# EasyEDA Pro project ProPrj_STM32H723、_2026-06-01.epro, board PCB1
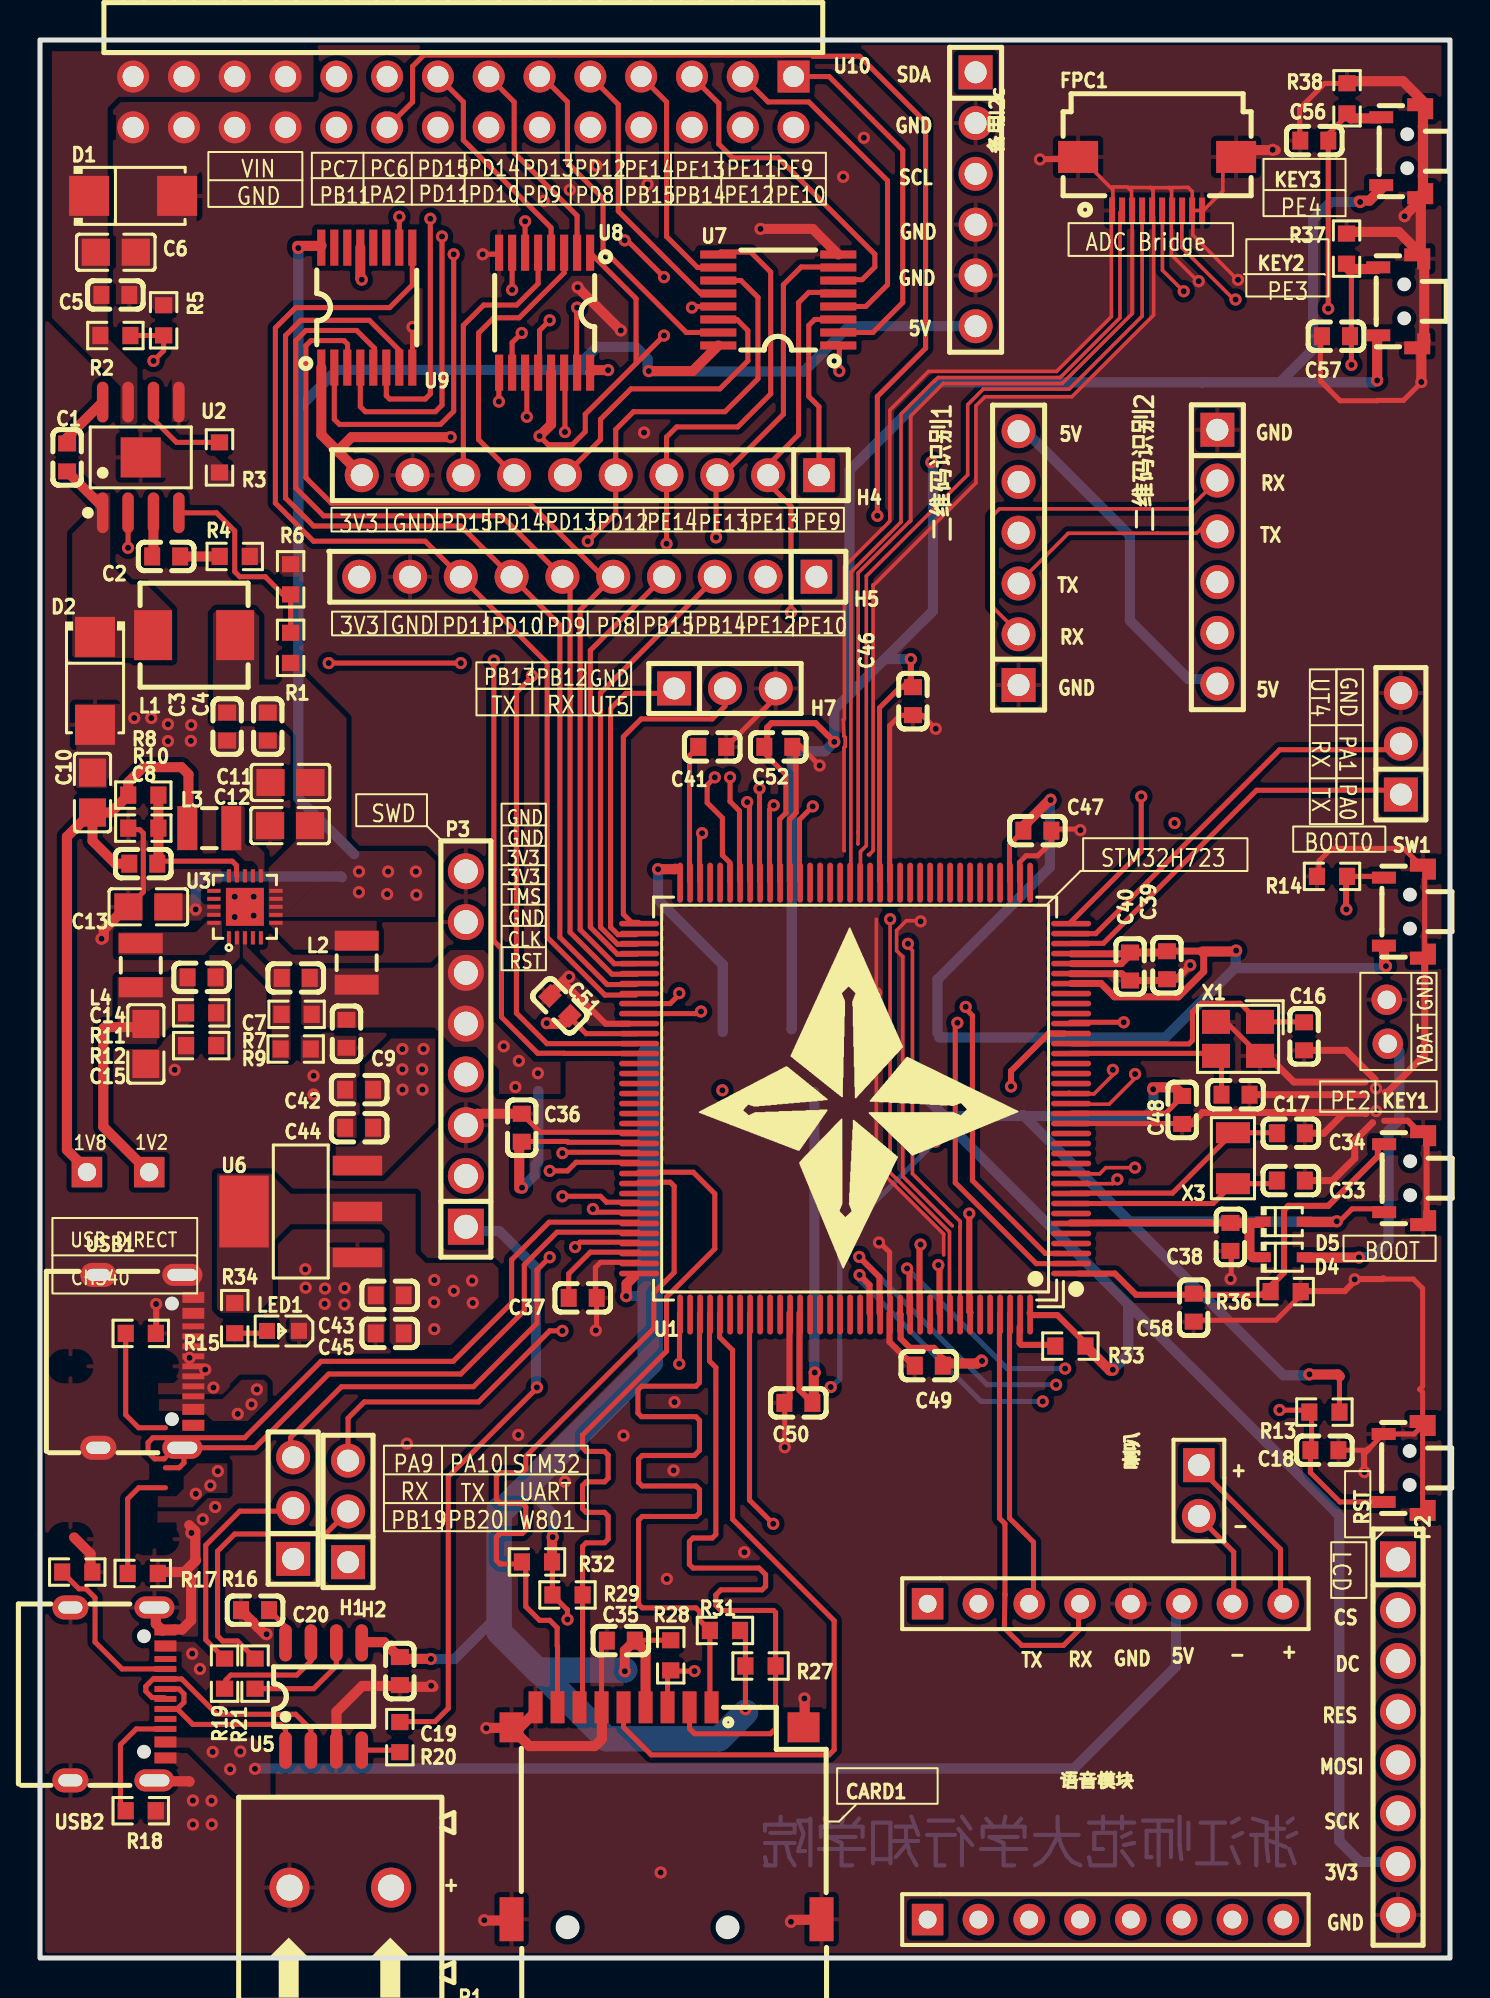
[diagram p4: board, top side]
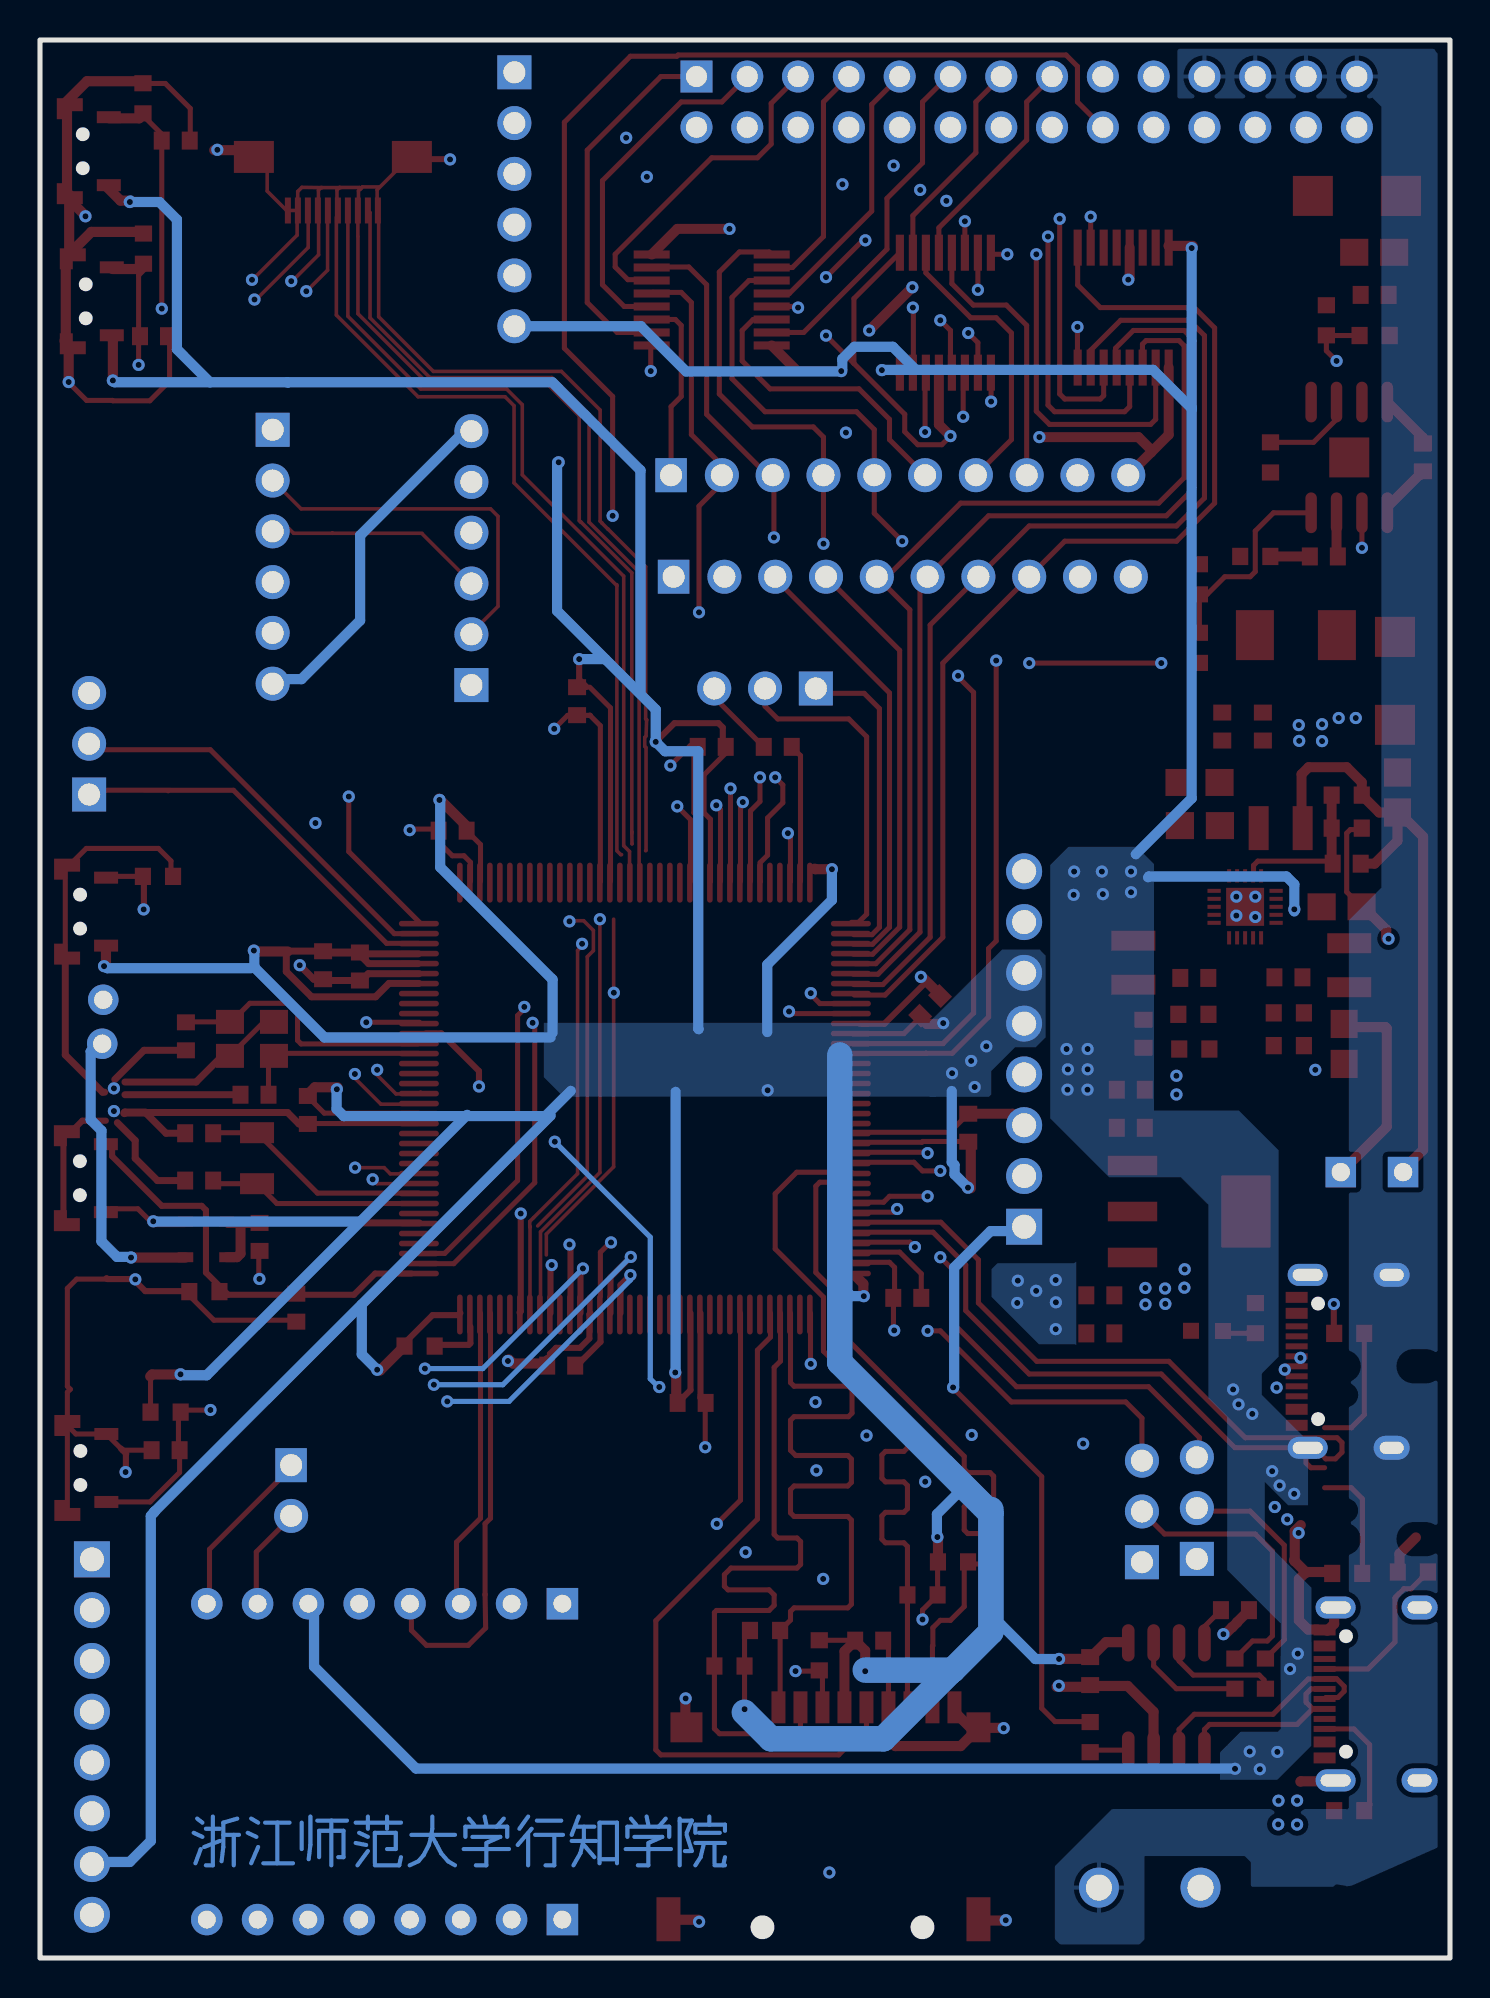
[diagram p5: board, bottom side, seen from below]

Outline 70.5 x 95.94 mm; copper layers: Top Layer, 内层1, 内层2, Bottom Layer. Coordinates in mm from the lower left corner of the outline.
Outline path: rectangle 0,95.94 70.5,0
Stack: Top Layer 0.035mm 外层铜厚1oz / Dielectric1 0.2104mm 7628 RC49% 8.6mil / 内层1 0.0152mm 内层铜厚 / Dielectric2 1.065mm 1.1mm H/HOZ Copper / 内层2 0.0152mm 内层铜厚 / Dielectric3 0.2104mm 7628 RC49% 8.6mil / Bottom Layer 0.035mm 外层铜厚1oz

## Design rules (mm)
spacing copperThickness1oz (default): track to track 0.102, other pairs 0.152 to 0.3
spacing copperThickness2oz: track to track 0.203, other pairs 0.152 to 0.3
spacing Plane_innerPlane: track to track 0.102, other pairs 0.152 to 0.3
spacing Copper_copperRegion: track to track 0.102, other pairs 0.152 to 0.3
track width copperThickness1oz (default): min 0.127, default 0.254, max 2.54
track width copperThickness2oz: min 0.203, default 0.254, max 2.54
differential pair differentialPair (default): width min 0.127, default 0.254, max 2.54; gap min 0.152, default 0.152
pour e2012 uses Copper_copperRegion
pour e2013 uses Copper_copperRegion
pour e2118 uses Copper_copperRegion
pour e2223 uses Copper_copperRegion
pour e2594 uses Copper_copperRegion
pour e2703 uses Copper_copperRegion
pour e2709 uses Copper_copperRegion
pour e2723 uses Copper_copperRegion

## Placement (name value [footprint] x y rotation side)
C1  100nF  [C0603]  1.36 75.06 270 top
C2  100pF  [C0603]  6.31 70.1 180 top
C3  100nF  [C0603]  9.36 61.59 90 top
C4  10uF  [C0603]  11.39 61.59 90 top
C5  100nF  [C0603]  3.77 83.18 180 top
C6  22uF  [C0805]  3.79 85.32 180 top
C7  18pF  [C0603]  12.78 49.02 0 top
C8  22pF  [C0603]  5.17 54.74 180 top
C9  10uF  [C0603]  15.33 46.23 90 top
C10  22uF  [C0805]  2.62 58.29 270 top
C11  22uF  [C0805]  12.52 58.8 0 top
C12  22uF  [C0805]  12.5 56.64 0 top
C13  22uF  [C0805]  5.42 52.58 0 top
C14  22pF  [C0603]  8.08 49.05 180 top
C15  22uF  [C0805]  5.29 45.72 90 top
C16  20pF  [C0603]  63.2 46.1 270 top
C17  20pF  [C0603]  59.77 43.18 180 top
C18  100nF  [C0603]  64.22 25.4 0 top
C19  100nF  [C0603]  17.99 14.35 90 top
C20  100nF  [C0603]  10.75 17.4 0 top
C33  20pF  [C0603]  62.54 38.89 0 top
C34  20pF  [C0603]  62.54 41.25 0 top
C35  10uF  [C0603]  29.04 15.88 0 top
C36  1uF  [C0603]  24.09 41.53 270 top
C37  4.7uF  [C0603]  27.14 33.02 0 top
C38  100nF  [C0603]  59.52 36.07 270 top
C39  10uF  [C0603]  56.35 49.66 270 top
C40  100nF  [C0603]  54.5 49.59 90 top
C41  4.7uF  [C0603]  33.61 60.58 180 top
C42  10uF  [C0603]  15.96 43.43 180 top
C43  10uF  [C0603]  17.48 33.15 180 top
C44  100nF  [C0603]  15.96 41.53 180 top
C45  100nF  [C0603]  17.48 31.24 180 top
C46  100nF  [C0603]  43.65 62.86 90 top
C47  100nF  [C0603]  49.87 56.39 180 top
C48  100nF  [C0603]  57.11 42.42 90 top
C49  100nF  [C0603]  44.44 29.63 0 top
C50  100nF  [C0603]  37.92 27.77 0 top
C51  100nF  [C0603]  25.99 47.62 315 top
C52  100nF  [C0603]  36.92 60.58 180 top
C56  100nF  [C0603]  63.71 90.9 180 top
C57  100nF  [C0603]  64.8 81.12 0 top
C58  100nF  [C0603]  57.68 32.53 270 top
CARD1  TF PUSH  [TF-SMD_TF-PUSH]  31.33 7.24 0 top
D1  SS34  [SMA_L4.3-W2.6-LS5.2-RD]  4.66 88.14 0 top
D2  SS34  [SMA_L4.3-W2.6-LS5.2-RD]  2.75 63.88 270 top
D4  B5819WS  [SOD-323_L1.7-W1.3-LS2.5-FD]  62.19 35.05 180 top
D5  B5819WS  [SOD-323_L1.7-W1.3-LS2.5-FD]  62.19 36.83 180 top
FPC1  AFC01-S10FCA-00  [FPC-SMD_P0.5-10P_FGS-XJ-H2.0]  55.86 88.75 0 top
H1  PZ254V-11-03P  [HDR-TH_3P-P2.54-V-M]  12.66 22.5 90 top
H2  PZ254V-11-03P  [HDR-TH_3P-P2.54-V-M]  15.4 22.34 90 top
H4  PZ254V-11-10P  [HDR-TH_10P-P2.54-V-M]  27.52 74.17 180 top
H5  PZ254V-11-10P  [HDR-TH_10P-P2.54-V-M]  27.39 69.09 180 top
H6  PZ254V-11-03P  [HDR-TH_3P-P2.54-V-M]  68.04 60.74 90 top
H7  PZ254V-11-03P  [HDR-TH_3P-P2.54-V-M]  34.25 63.5 0 top
H11  HDR-F-2.54_1x8  [HDR-F-2.54_1X8]  52 1.92 0 top
KEY1  TS24CA  [SW-SMD_TS24CA]  68.18 39.01 270 top
KEY2  TS24CA  [SW-SMD_TS24CA]  67.89 82.87 270 top
KEY3  TS24CA  [SW-SMD_TS24CA]  68.04 90.37 270 top
L1  4.7uH  [IND-SMD_L5.4-W5.2_FXL0530]  7.7 66.17 0 top
L2  2.2uH  [IND-SMD_L2.5-W2.0_MHCHL2520]  15.83 49.78 270 top
L3  2.2uH  [IND-SMD_L2.5-W2.0_MHCHL2520]  8.47 56.51 180 top
L4  2.2uH  [IND-SMD_L2.5-W2.0_MHCHL2520]  5.04 49.66 270 top
LED1  NCD0603R1  [LED0603-RD_RED]  12.15 31.37 180 top
NOREF  -  [Pad_e225]  2.35 39.31 0 top
NOREF#2  -  [Pad_e223]  67.39 45.73 0 top
NOREF#3  -  [Pad_e224]  67.34 47.93 0 top
NOREF#4  -  [Pad_e226]  5.46 39.31 0 top
P1  WJ500V-5.08-2P  [CONN-TH_2P-P5.00_WJ500V-5.08-2P]  15.01 3.52 180 top
P2  2.54-1*8P母环保  [HDR-TH_8P-P2.54-V-F-1]  67.9 11.05 270 top
P3  2.54-1*8P母环保  [HDR-TH_8P-P2.54-V-F-1]  21.29 45.47 90 top
R1  500kΩ  [R0603]  12.53 65.53 270 top
R2  100kΩ  [R0603]  3.77 81.15 180 top
R3  100kΩ  [R0603]  8.98 75.06 90 top
R4  100kΩ  [R0603]  9.74 70.1 180 top
R5  100kΩ  [R0603]  6.18 81.91 270 top
R6  100kΩ  [R0603]  12.53 68.96 270 top
R7  680kΩ  [R0603]  12.83 47.2 0 top
R8  300kΩ  [R0603]  5.17 58.17 180 top
R9  150kΩ  [R0603]  12.78 45.47 180 top
R10  150kΩ  [R0603]  5.17 56.51 0 top
R11  150kΩ  [R0603]  8.06 47.27 180 top
R12  150kΩ  [R0603]  8.06 45.63 0 top
R13  10kΩ  [R0603]  64.22 27.3 0 top
R14  10kΩ  [R0603]  64.6 54.1 0 top
R15  5.1kΩ  [R0603]  5.04 31.24 180 top
R16  5.1kΩ  [R0603]  5.14 19.24 180 top
R17  5.1kΩ  [R0603]  1.86 19.3 180 top
R18  5.1kΩ  [R0603]  5.04 7.37 180 top
R19  510Ω  [R0603]  9.23 14.22 90 top
R20  10kΩ  [R0603]  17.99 11.05 270 top
R21  510Ω  [R0603]  10.75 14.22 90 top
R27  10kΩ  [R0603]  36.03 14.6 0 top
R28  10kΩ  [R0603]  31.54 15.14 270 top
R29  10kΩ  [R0603]  26.37 18.16 0 top
R31  10kΩ  [R0603]  34.25 16.38 180 top
R32  10kΩ  [R0603]  24.85 19.81 180 top
R33  10kΩ  [R0603]  51.52 30.61 0 top
R34  470Ω  [R0603]  9.74 32 90 top
R36  10kΩ  [R0603]  62.28 33.33 180 top
R37  10kΩ  [R0603]  65.33 85.5 270 top
R38  10kΩ  [R0603]  65.35 93.02 270 top
RST  TS24CA  [SW-SMD_TS24CA]  68.16 24.51 270 top
SW1  TS24CA  [SW-SMD_TS24CA]  68.17 52.34 270 top
U1  STM32H723ZGT6  [LQFP-144_L20.0-W20.0-P0.50-LS22.0-BL]  40.76 42.99 90 top
U2  MP1584EN-LF-Z  [SOIC-8_L5.0-W4.0-P1.27-LS6.0-BL-EP2.0]  5.04 75.06 0 top
U3  TMI7003C  [QFN-20_L3.0-W3.0-P0.40-BL-EP1.9]  10.25 52.58 0 top
U5  CH340N  [SOP-8_L4.9-W3.9-P1.27-LS6.0-BL]  14.18 13.08 0 top
U6  AMS1117-3.3  [SOT-223-4_L6.5-W3.5-P2.30-LS7.0-BR]  13.04 37.34 0 top
U7  CD4504BPWR  [TSSOP-16_L5.0-W4.4-P0.65-LS6.4-TL]  36.92 82.93 180 top
U8  CD4504BPWR  [TSSOP-16_L5.0-W4.4-P0.65-LS6.4-TL]  25.23 82.3 270 top
U9  CD4504BPWR  [TSSOP-16_L5.0-W4.4-P0.65-LS6.4-TL]  16.34 82.55 90 top
U10  PZ254-2-14-W-2.5-G1  [HDR-TH_28P-P2.54-H-M-R2-C14-S2.54]  21.17 92.84 180 top
USB1  TYPE-C 16PIN 2MD(073)  [USB-C-SMD_TYPE-C-6PIN-2MD-073]  5.29 29.84 270 top
USB2  TYPE-C 16PIN 2MD(073)  [USB-C-SMD_TYPE-C-6PIN-2MD-073]  3.9 13.21 270 top
X1  25MHz  [CRYSTAL-SMD_4P-L3.2-W2.5-BL]  59.9 45.97 180 top
X3  32.768kHz  [CRYSTAL-SMD_L3.2-W1.5-1]  59.65 40 270 top
二维码识别1  PZ254V-11-06P  [HDR-TH_6P-P2.54-V-M]  48.93 70.02 90 top
二维码识别2  PZ254V-11-06P  [HDR-TH_6P-P2.54-V-M]  58.87 70.09 270 top
喇叭  HDR-M-2.54_1x2  [HDR-M-2.54_1X2]  57.94 23.38 270 top
备用I2c  PZ254V-11-06P  [HDR-TH_6P-P2.54-V-M]  46.78 87.97 270 top
语音模块  HDR-F-2.54_1x8  [HDR-F-2.54_1X8]  52 17.72 0 top

## Footprints (pads in the part's own frame, mm; a bottom-side part is the same pattern mirrored in y, then rotated)
C0603
  rect 0.8x0.9 smd: 1(-0.7,0) 2(0.7,0)
C0805
  rect 1.41x1.35 smd: 1(-1,0) 2(1,0)
CONN-TH_2P-P5.00_WJ500V-5.08-2P
  round 2 hole 1.3: 1(-2.54,0) 2(2.54,0)
CRYSTAL-SMD_4P-L3.2-W2.5-BL
  rect 1.4x1.2 smd: 1(-1.1,-0.85) 2(1.1,-0.85) 3(1.1,0.85) 4(-1.1,0.85)
CRYSTAL-SMD_L3.2-W1.5-1
  rect 1.05x1.7 smd: 1(-1.275,0) 2(1.275,0)
FPC-SMD_P0.5-10P_FGS-XJ-H2.0
  rect 0.3x1.3 smd: 1(-2.25,-1.339) 2(-1.75,-1.339) 3(-1.25,-1.34) 4(-0.75,-1.339) 5(-0.25,-1.34) 6(0.25,-1.339) 7(0.75,-1.339) 8(1.25,-1.339) 9(1.75,-1.339) 10(2.25,-1.34)
  rect 2x1.6 smd: 11(3.95,1.34) 12(-3.95,1.34)
HDR-F-2.54_1X8
  rect 1.575x1.575 hole 0.889: 1(-7.62,0)
  round 1.575 hole 0.889: 2(-5.08,0) 3(-2.54,0) 4(0,0) 5(2.54,0) 6(5.08,0) 7(7.62,0) 8(10.16,0)
HDR-M-2.54_1X2
  rect 1.7x1.575 hole 1.1: 1(-1.27,0)
  round 1.7 hole 1.1: 2(1.27,0)
HDR-TH_3P-P2.54-V-M
  rect 1.7x1.7 hole 1.1: 1(-2.54,0)
  round 1.7 hole 1.1: 2(0,0) 3(2.54,0)
HDR-TH_6P-P2.54-V-M
  rect 1.7x1.7 hole 1.1: 1(-6.35,0)
  round 1.7 hole 1.1: 2(-3.81,0) 3(-1.27,0) 4(1.27,0) 5(3.81,0) 6(6.35,0)
HDR-TH_8P-P2.54-V-F-1
  rect 1.8x1.8 hole 1.2: 1(-8.89,0)
  round 1.8 hole 1.2: 2(-6.35,0) 3(-3.81,0) 4(-1.27,0) 5(1.27,0) 6(3.81,0) 7(6.35,0) 8(8.89,0)
HDR-TH_10P-P2.54-V-M
  rect 1.575x1.7 hole 1.1: 1(-11.43,0)
  round 1.7 hole 1.1: 2(-8.89,0) 3(-6.35,0) 4(-3.81,0) 5(-1.27,0) 6(1.27,0) 7(3.81,0) 8(6.35,0) 9(8.89,0) 10(11.43,0)
HDR-TH_28P-P2.54-H-M-R2-C14-S2.54
  rect 1.6x1.6 hole 1.05: 1(-16.51,-1.27)
  round 1.6 hole 1.05: 2(-16.51,1.27) 3(-13.97,-1.27) 4(-13.97,1.27) 5(-11.43,-1.27) 6(-11.43,1.27) 7(-8.89,-1.27) 8(-8.89,1.27) 9(-6.35,-1.27) 10(-6.35,1.27) 11(-3.81,-1.27) 12(-3.81,1.27) 13(-1.27,-1.27) 14(-1.27,1.27) 15(1.27,-1.27) 16(1.27,1.27) 17(3.81,-1.27) 18(3.81,1.27) 19(6.35,-1.27) 20(6.35,1.27) 21(8.89,-1.27) 22(8.89,1.27) 23(11.43,-1.27) 24(11.43,1.27) 25(13.97,-1.27) 26(13.97,1.27) 27(16.51,-1.27) 28(16.51,1.27)
IND-SMD_L2.5-W2.0_MHCHL2520
  rect 1x2.2 smd: 1(-1.1,0) 2(1.1,0)
IND-SMD_L5.4-W5.2_FXL0530
  rect 1.9x2.5 smd: 1(-2.05,0) 2(2.05,0)
LED0603-RD_RED
  rect 0.8x0.8 smd: 1(-0.799,-0.004) 2(0.799,0.004)
LQFP-144_L20.0-W20.0-P0.50-LS22.0-BL
  oval 0.28x2 smd: 1(-8.75,-10.8) 2(-8.25,-10.8) 3(-7.75,-10.8) 4(-7.25,-10.8) 5(-6.75,-10.8) 6(-6.25,-10.8) 7(-5.75,-10.8) 8(-5.25,-10.8) 9(-4.75,-10.8) 10(-4.25,-10.8) 11(-3.75,-10.8) 12(-3.25,-10.8) 13(-2.75,-10.8) 14(-2.25,-10.8) 15(-1.75,-10.8) 16(-1.25,-10.8) 17(-0.75,-10.8) 18(-0.25,-10.8) 19(0.25,-10.8) 20(0.75,-10.8) 21(1.25,-10.8) 22(1.75,-10.8) 23(2.25,-10.8) 24(2.75,-10.8) 25(3.25,-10.8) 26(3.75,-10.8) 27(4.25,-10.8) 28(4.75,-10.8) 29(5.25,-10.8) 30(5.75,-10.8) 31(6.25,-10.8) 32(6.75,-10.8) 33(7.25,-10.8) 34(7.75,-10.8) 35(8.25,-10.8) 36(8.75,-10.8) 73(8.75,10.8) 74(8.25,10.8) 75(7.75,10.8) 76(7.25,10.8) 77(6.75,10.8) 78(6.25,10.8) 79(5.75,10.8) 80(5.25,10.8) 81(4.75,10.8) 82(4.25,10.8) 83(3.75,10.8) 84(3.25,10.8) 85(2.75,10.8) 86(2.25,10.8) 87(1.75,10.8) 88(1.25,10.8) 89(0.75,10.8) 90(0.25,10.8) 91(-0.25,10.8) 92(-0.75,10.8) 93(-1.25,10.8) 94(-1.75,10.8) 95(-2.25,10.8) 96(-2.75,10.8) 97(-3.25,10.8) 98(-3.75,10.8) 99(-4.25,10.8) 100(-4.75,10.8) 101(-5.25,10.8) 102(-5.75,10.8) 103(-6.25,10.8) 104(-6.75,10.8) 105(-7.25,10.8) 106(-7.75,10.8) 107(-8.25,10.8) 108(-8.75,10.8)
  oval 2x0.28 smd: 37(10.8,-8.75) 38(10.8,-8.25) 39(10.8,-7.75) 40(10.8,-7.25) 41(10.8,-6.75) 42(10.8,-6.25) 43(10.8,-5.75) 44(10.8,-5.25) 45(10.8,-4.75) 46(10.8,-4.25) 47(10.8,-3.75) 48(10.8,-3.25) 49(10.8,-2.75) 50(10.8,-2.25) 51(10.8,-1.75) 52(10.8,-1.25) 53(10.8,-0.75) 54(10.8,-0.25) 55(10.8,0.25) 56(10.8,0.75) 57(10.8,1.25) 58(10.8,1.75) 59(10.8,2.25) 60(10.8,2.75) 61(10.8,3.25) 62(10.8,3.75) 63(10.8,4.25) 64(10.8,4.75) 65(10.8,5.25) 66(10.8,5.75) 67(10.8,6.25) 68(10.8,6.75) 69(10.8,7.25) 70(10.8,7.75) 71(10.8,8.25) 72(10.8,8.75) 109(-10.8,8.75) 110(-10.8,8.25) 111(-10.8,7.75) 112(-10.8,7.25) 113(-10.8,6.75) 114(-10.8,6.25) 115(-10.8,5.75) 116(-10.8,5.25) 117(-10.8,4.75) 118(-10.8,4.25) 119(-10.8,3.75) 120(-10.8,3.25) 121(-10.8,2.75) 122(-10.8,2.25) 123(-10.8,1.75) 124(-10.8,1.25) 125(-10.8,0.75) 126(-10.8,0.25) 127(-10.8,-0.25) 128(-10.8,-0.75) 129(-10.8,-1.25) 130(-10.8,-1.75) 131(-10.8,-2.25) 132(-10.8,-2.75) 133(-10.8,-3.25) 134(-10.8,-3.75) 135(-10.8,-4.25) 136(-10.8,-4.75) 137(-10.8,-5.25) 138(-10.8,-5.75) 139(-10.8,-6.25) 140(-10.8,-6.75) 141(-10.8,-7.25) 142(-10.8,-7.75) 143(-10.8,-8.25) 144(-10.8,-8.75)
Pad_e223
  round 1.524 hole 0.914: 1(0,0)
Pad_e224
  round 1.524 hole 0.914: 1(0,0)
Pad_e225
  rect 1.524x1.524 hole 0.914: 1(0,0)
Pad_e226
  rect 1.524x1.524 hole 0.914: 1(0,0)
QFN-20_L3.0-W3.0-P0.40-BL-EP1.9
  rect 0.2x0.665 smd: 1(-0.8,-1.55) 2(-0.4,-1.55) 3(0,-1.55) 4(0.4,-1.55) 5(0.8,-1.55) 11(0.8,1.55) 12(0.4,1.55) 13(0,1.55) 14(-0.4,1.55) 15(-0.8,1.55)
  rect 0.665x0.2 smd: 6(1.55,-0.8) 7(1.55,-0.4) 8(1.55,0) 9(1.55,0.4) 10(1.55,0.8) 16(-1.55,0.8) 17(-1.55,0.4) 18(-1.55,0) 19(-1.55,-0.4) 20(-1.55,-0.8)
  rect 1.9x1.9 smd: 21(0,0)
R0603
  rect 0.806x0.864 smd: 1(-0.753,0) 2(0.753,0)
SMA_L4.3-W2.6-LS5.2-RD
  rect 2x2 smd: 1(-2.2,0) 2(2.2,0)
SOD-323_L1.7-W1.3-LS2.5-FD
  rect 0.78x0.5 smd: 1(-1.04,0) 2(1.04,0)
SOIC-8_L5.0-W4.0-P1.27-LS6.0-BL-EP2.0
  oval 0.574x2.038 smd: 1(-1.905,-2.769) 2(-0.635,-2.769) 3(0.635,-2.769) 4(1.905,-2.769) 5(1.905,2.769) 6(0.635,2.769) 7(-0.635,2.769) 8(-1.905,2.769)
  rect 2x2 smd: 9(0,0)
SOP-8_L4.9-W3.9-P1.27-LS6.0-BL
  oval 0.63x1.865 smd: 1(-1.905,-2.683) 2(-0.635,-2.683) 3(0.635,-2.683) 4(1.905,-2.683) 5(1.905,2.683) 6(0.635,2.683) 7(-0.635,2.683) 8(-1.905,2.683)
SOT-223-4_L6.5-W3.5-P2.30-LS7.0-BR
  rect 2.47x0.98 smd: 1(2.835,-2.3) 2(2.835,0) 3(2.835,2.3)
  rect 2.47x3.6 smd: 4(-2.835,0)
SW-SMD_TS24CA
  custom 1.05x1.3 smd: 1(-2.125,0.975) 2(2.125,0.975)
  rect 0.6x1.2 smd: 3(-1.7,-0.975) 4(1.7,-0.975)
TF-SMD_TF-PUSH
  rect 0.7x1.6 smd: 1(2.25,5.3) 2(1.15,5.3) 3(0.05,5.3) 4(-1.05,5.3) 5(-2.15,5.3) 6(-3.25,5.3) 7(-4.35,5.3) 8(-5.45,5.3) CD(-6.55,5.3)
  rect 1.2x1.5 smd: 10(-7.75,4.3)
  rect 1.2x2.2 smd: 11(-7.75,-5.3) 12(7.75,-5.3)
  rect 1.6x1.5 smd: 13(6.85,4.3)
TSSOP-16_L5.0-W4.4-P0.65-LS6.4-TL
  rect 1.804x0.406 smd: 1(-3,2.275) 2(-3,1.625) 3(-3,0.975) 4(-3,0.325) 5(-3,-0.325) 6(-3,-0.975) 7(-3,-1.625) 8(-3,-2.275) 9(3,-2.275) 10(3,-1.625) 11(3,-0.975) 12(3,-0.325) 13(3,0.325) 14(3,0.975) 15(3,1.625) 16(3,2.275)
USB-C-SMD_TYPE-C-6PIN-2MD-073
  rect 0.55x1.1 smd: 1(-3.2,2.375) 2(-2.4,2.375) 11(2.4,2.375) 12(3.2,2.375)
  rect 0.3x1.1 smd: 3(-1.75,2.375) 4(-1.25,2.375) 5(-0.75,2.375) 6(-0.25,2.375) 7(0.25,2.375) 8(0.75,2.375) 9(1.25,2.375) 10(1.75,2.375)
  oval 1.1x2 hole 0.6x1.5: 13(-4.325,1.825) 14(4.325,1.825)
  oval 1.2x1.8 hole 0.6x1.2: 13(-4.325,-2.375) 14(4.325,-2.375)

## Nets
As in the schematic, except:
1V2: C14.2 C15.2 L4.2 NOREF#4.1 R11.2
1V8: C8.2 C10.2 L3.2 NOREF.1 R8.2
5V_IN: C3.2 C4.2 C11.2 C12.2 C13.2 C42.1 C44.1 L1.2 R1.2 U3.7 U3.8 U3.9 U3.10 U3.18 U3.19 U6.3 U7.16 U8.16 U9.16 USB1.2 USB1.11 USB2.2 USB2.11 二维码识别1.6 二维码识别2.6 备用I2c.6 语音模块.6
GND: C3.1 C4.1 C5.1 C6.1 C9.1 C10.1 C11.1 C12.1 C13.1 C15.1 C16.2 C17.1 C18.2 C19.1 C20.1 C33.2 C34.2 C35.1 C36.1 C37.2 C38.2 C39.2 C40.1 C41.1 C42.2 C43.2 C44.2 C45.2 C46.1 C47.1 C48.1 C49.1 C50.1 C51.1 C52.1 C56.2 C57.1 C58.2 CARD1.6 CARD1.10 CARD1.11 CARD1.12 CARD1.13 CARD1.CD D1.2 D2.2 FPC1.1 FPC1.3 FPC1.5 FPC1.7 FPC1.9 FPC1.10 FPC1.11 FPC1.12 H4.9 H5.9 H6.3 H7.3 KEY1.1 KEY1.2 KEY2.1 KEY2.2 KEY3.1 KEY3.2 LED1.1 NOREF#3.1 P1.2 P2.8 P3.3 P3.7 P3.8 R3.1 R4.1 R5.1 R6.1 R9.1 R10.1 R12.1 R14.1 R15.1 R16.1 R17.1 R18.1 R36.1 R37.1 R38.1 RST.1 RST.2 RST.3 SW1.1 SW1.2 U1.16 U1.31 U1.38 U1.51 U1.61 U1.83 U1.94 U1.107 U1.120 U1.130 U2.5 U2.9 U3.21 U5.3 U6.1 U7.8 U8.8 U9.8 U10.22 U10.24 U10.26 U10.28 USB1.1 USB1.12 USB1.13 USB1.14 USB2.1 USB2.12 USB2.13 USB2.14 X1.2 X1.4 二维码识别1.1 二维码识别2.1 备用I2c.2 备用I2c.4 备用I2c.5 语音模块.5
VBAT: D4.1 NOREF#2.1
PB6_I2C1_SCL: U1.136 备用I2c.3
PB7_I2C1_SDA: U1.137 备用I2c.1
PE0_UART8_RX: U1.141 语音模块.4
PE1_UART8_TX: U1.142 语音模块.3
PF6_UART7_RX: U1.18 二维码识别1.2 二维码识别2.2
PF7_UART7_TX: U1.19 二维码识别1.3 二维码识别2.3
SPK+: 喇叭.1 语音模块.8
SPK-: 喇叭.2 语音模块.7

Pads without a net: H11 1 2 3 4 5 6 7 8; P2 1; U1 4 5 7 12 13 14 15 20 21 22 27 28 29 37 40 41 42 48 53 56 57 58 59 68 69 87 88 89 90 91 92 93 100 110 114 115 117 118 119 122 134 139 140; U3 1 4 5 12 13 15 16 17; U9 11 12 14 15; USB1 3 9; USB2 3 9; 二维码识别1 4 5; 二维码识别2 4 5

## Via types
v1: diameter 0.61, hole 0.305, Top Layer to Bottom Layer, 222 vias

## Routing (per net, layer and track width the routed paths; a pad name or vN(x,y) marks a point on that pad's centre or on a via; arc(x,y) is an arc through that point)
1V2: length 10
  Top Layer w0.508: 4.95,46.56 3.24,46.56 3.17,46.49 3.17,41.58 5.46,39.28
1V8: length 31.2
  Top Layer w0.5: C8.2 3.77,54.74 2.62,55.88 C10.2 3.54,57.29 R8.2 4.41,58.81 5.17,59.56 7.07,59.56 7.42,59.21 7.42,56.57 L3.2
  Top Layer w0.508: 2.39,57.13 1.35,56.09 1.35,40.42 2.33,39.44
3V32: length 536.1
  Top Layer w0.254: 64.93,36.8 65.6,37.47 66.93,37.47 67.02,37.37 ; R31.1 35.27,16.11 R27.1 v1(35.27,12.45) ; U8.1 29.8,83 29.8,79.76 ; 36.98,53.85 36.98,53.86 36.98,56.96 37.3,57.28 37.3,59.18 36.21,60.26 C52.2 ; v1(39.96,79.37) 39.96,80.61 U7.1 ; 41.98,53.85 41.98,62.53 43.01,63.56 ; v1(26.37,16.93) 26.37,17.41 R29.1 25.62,19.79 R32.1 ; C51.2 26.52,47.09 26.52,47.02 27.31,46.23 29.86,46.23 ; v1(32.6,82.55) 32.65,82.61 U7.13 ; 49.17,56.39 48.48,55.69 48.48,53.85 ; R28.1 29.76,15.89 ; C48.2 57.11,43.08 56.29,42.26 51.57,42.26 ; 29.92,40.8 26.4,40.8 26.36,40.84 24.1,40.84 ; 29.8,79.76 v1(31.2,81.15) ; 29.8,79.76 27.26,77.22 27.26,76.34 26.61,75.69 25.41,75.69 v1(24.98,76.12) ; 64.98,29.09 64.97,29.08 R13.2
  Top Layer w0.305: 49.48,32.26 49.58,32.16 50.87,32.16 52.4,30.63 52.41,30.63 ; 45.11,29.84 45.11,29.91 45,30.01 45,30.21 44.7,30.52 43.5,30.52 43.03,30.99 43.03,32.2 42.98,32.25 ; 37.98,32.25 37.98,28.41 C50.2 ; v1(43.54,64.97) 43.54,63.95 43.17,63.58 ; v1(39.71,60.83) 38.78,61.76 36.58,61.76 36.36,61.55 36.36,60.5 36.3,60.43
  Top Layer w0.35: C39.1 56.44,50.36 56.45,50.36 58.08,50.36 58.19,50.26 58.19,49.34 56.92,48.08 53.72,48.08 53.05,48.75 51.56,48.75 ; 54.5,50.24 54.5,50.18 54.07,49.74 51.59,49.74 ; 54.5,50.24 54.49,50.23 51.58,50.23 ; 54.5,50.24 C40.2
  Top Layer w0.4: C40.2 56.28,50.29 C39.1
  Top Layer w0.5: v1(24.98,76.12) 25.56,76.7 U8.13 ; CARD1.4 30.28,15.34 C35.2 29.24,15.37 v1(29.24,14.34) ; 14.94,75.31 H4.10 ; 14.94,75.31 14.07,76.19 U9.1 ; 14.94,75.31 14.94,75.44 15.58,76.07 v1(20.53,76.07) ; v1(16.09,83.95) 16.02,84.02 U9.13
  Top Layer w0.508: 66.83,80.97 66.86,80.94 v1(66.86,78.91) ; 67.25,50.51 67.2,50.46 67.2,49.61 ; 31.76,54.49 31.74,54.46 v1(30.9,54.46) ; 25.55,19.94 25.6,19.99 25.6,21.13 ; 59.72,50.34 58.12,50.34 ; 24.02,40.82 23.96,40.76 23.96,38.5 ; 16.14,15.8 17.2,15.8 17.99,15.01 ; 17.97,14.99 18,14.96 19.53,14.96 ; 29.7,34.09 29.33,33.72 29.33,33.19 29.32,33.18 ; 64.99,29.09 64.89,29.19 63.42,29.19 ; 38.69,29.31 38.69,27.9 38.63,27.84 ; 67.13,88.56 66.48,87.9 65.94,87.9 ; 50.55,57.99 49.09,56.54 49.06,56.54 ; v1(64.84,36.85) 64.8,36.81 63.25,36.81 ; 47.06,29.94 46.85,29.74 45.28,29.74 45.11,29.91 45.08,29.88 ; 53.6,29.39 53.5,29.39 52.21,30.68 ; 57.04,43.27 56.75,43.55 55.62,43.55 ; 25.48,46.72 26.16,46.72 26.52,47.09 26.55,47.12
  内层2 w0.254: v1(39.96,79.37) 32.98,79.37 v1(31.2,81.15) v1(32.6,82.55)
  内层2 w0.5: 26.76,14.34 26.37,14.73 v1(26.37,16.93) ; 26.76,14.34 26.76,12.06 28.02,10.79 33.62,10.79 v1(35.27,12.45) ; 26.76,14.34 v1(29.24,14.34) ; v1(20.53,76.07) 24.93,76.07 v1(24.98,76.12) ; 44.49,74.73 44.53,74.78 44.53,74.8 v1(39.96,79.37) ; H5.10 15.96,74.04 H4.10 v1(16.09,83.95)
  内层2 w0.508: 34.12,43.37 40.99,36.5 42.24,36.5 42.66,36.08 42.66,35.49 42.64,35.48 42.64,34.19 43.06,33.78 43.71,33.78 47.1,30.39 v1(47.1,29.86)
  Bottom Layer w0.508: 63.47,29.15 62.17,29.15 49.2,42.11 ; 49.2,42.11 45.23,42.11 43.96,43.38 ; 49.2,42.11 55.31,42.11 55.67,42.47 55.67,43.42 ; 49.2,42.11 49.14,42.17 ; 53.65,29.43 54.41,30.19 54.41,32.68 ; 24.59,23.26 25.65,22.2 25.65,21.07 ; 62,78.82 66.77,78.82 v1(66.86,78.91) ; 62,78.82 63.65,80.47 63.65,86.95 64.53,87.83 v1(66.01,87.83) ; 62,78.82 58.13,78.82 ; 64.81,22.27 64.81,22.29 64.77,22.34 ; 58.11,78.79 58.13,78.82 ; 58.13,78.82 44.88,78.82 40.48,74.41 40.48,63.35 ; 44.65,74.82 44.65,67.38 42.33,65.07 ; 64.77,22.34 64.96,22.11 64.96,5.86 66.01,4.8 67.46,4.8 67.7,4.57 ; 64.77,22.34 44.96,42.14 ; 59.78,50.3 59.78,49.55 56.27,46.04 44.97,46.04 ; 65.98,87.91 66.05,87.84 ; 67.23,49.6 67.13,49.51 59.95,49.51 ; 19.55,14.95 20.72,14.95 22.78,17.01 ; v1(43.54,64.97) 42.24,64.97 39.71,62.45 v1(39.71,60.83) 39.24,60.36 37.59,60.36 37.59,46.48 37.57,46.45 ; 29.37,33.11 29.93,33.11 30.27,33.45 ; 44.87,46.28 44.87,48.95 50.49,54.56 50.49,57.96 ; 24.91,43.37 24.91,39.8 24.77,39.66 24.77,39.2 v1(24.1,38.53) ; 38.72,43.32 38.72,29.31 v1(38.74,29.29) ; 34.14,46.32 34.14,49.69 30.9,52.92 v1(30.9,54.46) ; 54.62,36.84 64.83,36.84 v1(64.84,36.85)
  Bottom Layer w1.27: 29.23,14.4 24.87,14.4 22.95,16.31 22.95,22.23 ; 35.28,12.29 33.96,10.97 28.33,10.97 25.04,14.26 25.04,14.32 ; 22.95,22.23 30.51,29.79 30.51,45.17 ; 22.95,22.23 22.95,22.43
  vias: v1(19.55,14.96) v1(23.18,45.6) v1(23.77,43.57) v1(23.94,44.87) v1(24.9,44.26) v1(25.34,46.76) v1(25.63,21.05) v1(29.31,33.1) v1(34.12,43.4) v1(44.57,74.81) v1(50.53,57.92) v1(53.64,29.42) v1(55.66,43.45) v1(59.81,50.39) v1(63.47,29.19) v1(67.3,49.61)
3V32_2:
  vias: v1(19.71,33.91) v1(19.7,32.8) v1(19.71,31.45) v1(20.69,33.37) v1(21.61,33.88) v1(21.64,32.77)
5V_IN: length 162.6
  Top Layer w0.5: U8.16 27.63,79.42 v1(28.41,79.42) ; U7.16 32.63,79.37 v1(30.44,79.37)
  Top Layer w0.508: 12.86,85.64 14.06,85.64 14.07,85.65
  内层2 w0.5: v1(28.41,79.42) 30.39,79.42 v1(30.44,79.37)
  内层2 w0.508: 46.93,81.64 47.15,81.42 49.01,81.42 49.32,81.11 49.32,76.7
  Bottom Layer w0.508: 7.78,52.35 7.78,53.7 8.18,54.1 15.06,54.1 15.1,54.05 ; 46.26,81.62 40.46,81.62 38.19,79.36 30.48,79.36 ; 12.92,77.5 v1(12.92,85.53) ; 12.92,77.5 14.85,79.43 28.41,79.43 ; 12.92,77.5 12.92,58 15.71,55.21 ; 12.92,77.5 12.9,77.49 ; 10.79,9.48 51.7,9.48 56.8,14.58 56.8,17.5 57.1,17.79 ; 48.83,76.82 54.49,71.15 54.49,66.9 57.43,63.97 58.78,63.97 ; 30.39,79.48 30.39,79.98 29.78,80.59 27.86,80.59 26.76,79.5
  vias: v1(7.61,15.22) v1(7.78,52.45) v1(7.79,23.22) v1(8,14.46) v1(8.52,23.63) v1(8.63,10.31) v1(8.89,24.35) v1(9.51,9.44) v1(9.89,27.22) v1(10.01,10.33) v1(10.57,27.69) v1(10.75,9.46) v1(10.84,28.44) v1(15.95,54.34) v1(15.95,53.31) v1(17.36,53.21) v1(17.41,54.34) v1(18.12,45.47) v1(18.12,44.45) v1(18.13,43.43) v1(18.79,54.34) v1(18.82,53.18) v1(19.11,44.45) v1(19.13,43.43) v1(19.17,45.47)
GND: length 676.9
  Top Layer w0.18: 59.14,89.38 59.14,88.38 58.17,87.41 ; 40.91,56.33 40.91,69.28 43.45,71.83 43.47,71.83 43.54,71.89 43.54,77.13 ; 40.91,56.33 40.91,56.25 ; 40.91,56.33 40.9,55.73 40.9,55.73 ; 54.47,88.5 54.53,88.56 55.52,88.56 55.53,88.55 ; 54.47,88.5 54.38,88.59 53.54,88.59 ; 54.47,88.5 54.58,88.39 54.58,87.88 ; 54.47,88.5 54.46,88.49 ; 55.53,88.55 55.46,88.55 ; 55.53,88.55 55.65,88.43 55.65,87.98 55.61,87.94 ; 55.53,88.55 56.41,88.55 ; 40.17,61.93 40.22,61.98 40.22,69.59 42.09,71.46 42.09,71.46 42.42,71.78 42.42,71.79 42.49,71.87 42.49,77.43 44.43,79.36 50.83,79.36 53.57,82.09 53.57,87 ; 40.17,61.93 40.2,61.12 40.26,61.06 40.26,60.6 40.2,60.54 40.2,55.4 40.22,55.38 ; 40.17,61.93 40.17,61.9 ; 58.17,87.41 58.18,87.41 ; 58.17,87.41 FPC1.9 ; 43.92,51.81 43.84,51.88 43.32,51.88 42.83,51.4 42.83,50.39 43.14,50.08 43.14,39.1 45.62,36.62 ; 41.66,68.64 46.8,73.78 46.8,77.64 47.25,78.09 51.59,78.09 55.68,82.18 55.68,87.07 ; 41.66,68.64 41.66,55.39 ; 41.66,68.64 41.66,68.69 ; 57.9,83.86 56.57,85.19 56.57,87 ; 52.19,89.9 53.64,88.44 53.64,87.65 ; 43.55,77.15 45.16,78.76 51.11,78.76 54.6,82.24 54.6,86.1 ; 45.18,35.17 45.18,36.21 41.82,39.57 41.82,51.96 ; 59.81,84.01 57.64,86.17 57.64,87.03 ; 54.61,86.11 FPC1.3 ; 41.42,55.19 41.46,55.19 41.65,55.38 ; 57.61,87.94 57.61,88.36 57.41,88.56 56.41,88.55 ; 56.41,88.55 56.45,88.55 56.58,88.42 56.58,87.98 56.61,87.95
  Top Layer w0.254: C52.1 37.8,60.58 37.8,57.28 37.48,56.95 37.48,53.85 ; RST.1 69.13,28.3 68.98,28.45 69.13,28.6 69.13,33.49 68.67,33.96 67.18,33.96 ; RST.1 RST.2 ; RST.1 68.71,26.21 RST.3 66.45,25.48 ; 64.02,81.11 64.02,78.88 65.01,77.89 66.86,77.89 66.88,77.91 68.17,77.91 69.07,78.8 ; 41.99,35.79 42.48,35.3 42.48,33.09 ; 69.24,50.2 69.24,54.45 68.19,55.5 64.58,55.5 63.95,54.87 63.95,54.21 R14.1 ; 57.67,31.9 61.8,31.9 63.16,33.26 ; 59.51,35.44 59.56,35.39 59.56,34.01 ; CARD1.6 28.08,15.61 28.34,15.88 ; v1(52.02,56.41) 51.96,56.47 50.64,56.47 ; v1(22.14,85.22) 22.88,85.22 U8.8 ; C18.2 66.37,25.4 ; 37.62,60.63 37.99,60.63 v1(38.98,59.65) ; C48.1 57.09,41.74 51.59,41.74 ; C37.2 27.77,33.08 27.77,34.54 28.02,34.8 29.92,34.8 29.92,34.8 ; H7.3 36.79,63.05 C41.1 ; X1.4 59.3,46.82 X1.2 ; 27.79,31.47 27.83,31.5 27.83,32.89 ; C13.1 5.17,53.32 5.17,56.26 4.99,56.44 4.49,56.44 R10.1 ; v1(37.24,25.55) 37.24,27.82 ; 29.92,41.3 25.01,41.3 C36.1 ; 62.99,91 62.99,92.51 64.23,93.76 65.17,93.76 ; U9.8 18.63,79.56 v1(18.63,81.58) ; 43,62.15 42.98,62.15 ; 43,62.15 43.01,62.16 ; 43,62.15 44.12,62.15 v1(44.79,61.48) ; 43,62.15 42.48,61.64 42.48,53.86 42.48,53.85 ; C47.1 50.57,55.82 49.88,55.13 49.3,55.13 48.98,54.81 48.98,53.85
  Top Layer w0.3: 52.02,89.98 50.01,89.98 v1(50,89.96)
  Top Layer w0.305: 5.81,32.57 5.81,31.29 5.81,31.29 ; 69.33,41.18 69.33,36.83 69.33,36.83 ; 67.17,34.01 67.12,33.96 65.69,33.96 ; 69.27,41.28 68.98,41.28 68.38,41.88 67.21,41.88 ; 37.48,32.25 37.48,28.02 37.24,27.79 C50.1 ; 43.71,29.84 43.45,29.84 42.48,30.82 42.48,32.25 ; 66.21,24.43 66.21,25.2 ; 26.17,48.78 26.23,48.78 28.28,46.73 29.47,46.73 ; 66.45,25.48 66.19,25.22 ; 62.99,33.36 65.23,33.36 65.73,33.86
  Top Layer w0.35: C33.2 64.63,38.89 65.74,40 65.74,40.89 66.63,41.78 ; 51.54,49.23 54.08,49.23 54.5,48.81 54.5,48.77 ; C34.2 64.2,41.25 65.24,42.29 58.12,42.29 57.55,41.72 C48.1 ; 66.25,43.81 62.7,43.81 61.39,45.12 X1.4 ; v1(57.51,49.66) 56.81,48.96 56.35,48.96 56.28,48.89 C40.1 ; 69.24,50.2 69.24,45.17 67.37,43.31 67.27,43.31 ; 66.76,43.94 65.3,45.4 C16.2 ; 60.48,43.18 66.25,43.18
  Top Layer w0.4: 65.24,42.29 66.25,42.29 66.28,42.26
  Top Layer w0.5: C36.1 21.87,42.23 P3.3 ; U7.8 38.63,86.49 v1(36.03,86.49) ; v1(26.88,83.57) v1(29.04,81.41)
  Top Layer w0.508: 69.01,85.26 67.93,86.34 65.17,86.34 ; 6.16,16.38 6.13,16.38 5.79,16.72 5.79,17.43 5.81,17.45 ; 7.76,19.84 7.76,19.85 ; 7.76,19.85 7.8,19.89 ; 7.76,19.85 7.76,21.35 7.46,21.65 ; 7.76,19.85 7.21,19.3 ; 24.8,12.34 23.9,11.43 23.56,11.43 ; 65.48,93.87 68.15,93.87 69.18,92.84 ; 38.23,12.93 38.23,11.85 38.21,11.83 ; 6,19.34 6.03,19.31 7.2,19.31 7.21,19.3 ; 39.3,1.94 39.28,1.91 37.57,1.91 ; 25.58,48.25 25.58,48.26 26.45,49.12 ; 7.21,19.3 7.18,19.27 ; 7.21,19.3 7.56,18.95 7.56,16.89 7.1,16.43 6.63,16.43 ; 69.04,88.21 69.04,87.96 ; 69.04,87.96 69.04,85.38 69.17,85.26 ; 69.04,87.96 68.27,87.19 ; 69.04,87.96 69.19,88.1 ; 69.26,88.35 69.15,88.46 69.15,92.62 ; 1.71,21.04 2.53,20.22 2.53,19.33 ; v1(69.07,78.83) 69.07,80.52 69.14,80.59 ; 60.45,90.38 60.49,90.43 61.79,90.43 ; 22.31,11.51 23.39,11.51 23.44,11.56 ; 7.48,8.82 7.46,8.84 5.83,8.84 ; 19.67,13.57 18.09,13.57 18.02,13.64 ; 18,13.6 17.99,13.61 16.11,13.61 14.82,12.32 14.82,10.82 ; 69.27,80.89 69.21,80.95 69.21,84.92 ; v1(11.33,16.2) 11.25,16.2 10.9,16.54 10.89,16.54 10.65,16.78 10.65,16.79 10.05,17.39 ; 23.68,11.39 24.47,10.6 27.73,10.6 28.09,10.96 28.09,12.02 27.99,12.12 ; 23.49,1.92 23.45,1.87 22.22,1.87 ; 4.26,52.51 3.19,51.44 3.19,50.99
  内层1 w0.18: 42.97,65.17 42.97,77.14 44.95,79.12 44.95,84.98 46.7,86.74 ; 41.57,51.88 42.32,51.14 42.83,51.14 ; 41.57,51.88 41.59,51.86 ; 41.57,51.88 41.15,52.3 41.17,76.38 43.9,79.1 43.9,92.49 44.02,92.62 45.8,92.62 46.75,91.66 ; 42.96,65.12 42.96,52.57 ; 42.96,52.57 42.96,52.55 ; 42.96,52.57 42.96,52.55 42.96,52.55 ; 55,40.05 55.38,40.05 61.42,46.1 61.42,80.14 57.94,83.62 v1(57.94,83.87) ; 42.96,52.55 42.99,52.25 43.05,52.19 43.05,51.33 42.85,51.14 ; v1(59.9,83.94) 59.91,83.94 62.69,81.16 62.69,44.85 56.45,38.61 54.99,38.61 54.62,38.98
  内层2 w0.5: 21.25,84.33 18.63,81.71 v1(18.63,81.58) ; 21.25,84.33 v1(22.14,85.22) ; 21.25,84.33 23.35,84.33 ; 18.63,72.35 18.63,74.17 ; 18.63,72.35 18.63,69.21 H5.9 ; 18.63,72.35 19.77,73.49 19.77,80.69 23.35,84.27 23.35,84.33 ; 23.35,84.33 26.12,84.33 v1(26.88,83.57) ; v1(29.04,81.41) 29.93,81.41 35.01,86.49 v1(36.03,86.49) 46.31,76.2 46.31,74.17
  vias: v1(3.07,50.98) v1(4.71,62.02) v1(5.56,62.02) v1(5.81,32.71) v1(6.4,61.71) v1(6.4,60.87) v1(6.73,44.42) v1(7.54,60.88) v1(7.48,30.02) v1(7.56,61.67) v1(7.57,21.26) v1(7.65,7.88) v1(7.65,6.68) v1(8.14,21.94) v1(8.26,29.43) v1(8.58,7.87) v1(8.59,6.68) v1(8.67,28.53) v1(8.76,22.56) v1(9.74,53.09) v1(9.74,52.07) v1(10.68,53.09) v1(10.68,52.14) v1(13.27,34.45) v1(13.28,33.53) v1(13.68,44.13) v1(13.68,43.19) v1(14.25,33.49) v1(14.23,32.72) v1(15.23,33.51) v1(15.23,32.69) v1(18.34,25.73) v1(19.56,13.62) v1(22.21,1.89) v1(22.32,11.5) v1(23.92,26.16) v1(25.18,87.89) v1(26.24,23.82) v1(26.45,49.08) v1(26.49,88.44) v1(27.82,89.65) v1(27.79,31.39) v1(29.17,26.13) v1(30.2,76.3) v1(30.38,88.72) v1(31.03,4.28) v1(31.34,18.96) v1(31.73,27.81) v1(31.68,24.39) v1(35.22,20.3) v1(37.55,1.81) v1(38.22,12.98) v1(40.16,89.09) v1(41.19,91.05) v1(41.81,48.28) v1(41.95,35.79) v1(44.03,51.85) v1(59.53,33.97) v1(61.63,90.44) v1(65.73,33.94) v1(66.22,24.31) v1(66.8,43.5) v1(66.8,42.36) v1(68.23,87.12)
VBAT: length 15
  Top Layer w0.508: v1(65.95,35.04) 65.95,35.03 63.23,35.03
  Bottom Layer w0.508: 65.91,35.07 66.65,35.07 67.43,35.85 67.43,41.38 67.96,41.92 67.96,45.34 67.46,45.85
BOOT0: length 40.9
  Top Layer w0.254: 67.18,54.02 67.1,54.1 R14.2
  Top Layer w0.305: v1(46.46,37.24) 46.46,32.34 46.51,32.29 46.51,32.26 ; v1(65.32,52.45) 65.31,52.46 65.31,54.25
  内层2 w0.305: v1(46.46,37.24) 44.85,37.24 43.83,38.26 43.83,41.12 48.67,45.96 56.42,45.96 62.93,52.47 65.46,52.47
CH340_RX: length 11
  Top Layer w0.254: 12.53,22.35 9.99,22.35 8.29,20.65 8.29,15.92 R19.2
CH340_TX: length 13.9
  Top Layer w0.254: R21.2 9.87,15.86 9.13,15.86 8.88,16.11 8.88,20.35 9.74,21.21 14.28,21.21 H2.2
EN: length 15.5
  Top Layer w0.254: R2.1 6.17,81.15 R5.2 6.18,80.39 v1(5.67,79.88) ; 4.4,72.29 v1(4.4,70.54)
  内层2 w0.254: v1(4.4,70.54) 3.51,71.42 3.51,77.72 v1(5.67,79.88)
FB1: length 7.9
  Top Layer w0.254: U3.14 9.82,54.15 9.82,54.65 9.61,54.86 5.99,54.86
  Top Layer w0.5: R8.1 R10.2 5.92,54.79 C8.1
FB4: length 10.4
  Top Layer w0.254: U2.4 8.82,72.29 9.74,71.37 9.74,69.34 9.99,69.09 11.26,69.09 12.14,68.21 R6.2 R1.1
OSC32_IN: length 10.7
  Top Layer w0.254: 51.59,37.74 58.66,37.74 X3.2 61.69,38.73 C33.1
OSC32_OUT: length 11.5
  Top Layer w0.254: C34.1 61.82,41.28 X3.1 56.63,38.26 51.57,38.26
OSC_IN: length 9.3
  Top Layer w0.254: 51.58,45.25 58.61,45.25 58.74,45.12 X1.3 59.08,44.85 C17.2
OSC_OUT: length 13.7
  Top Layer w0.254: 51.61,45.72 57.44,45.72 57.62,45.9 57.62,47.32 57.82,47.52 57.82,47.54 57.99,47.7 58.01,47.7 58.06,47.75 60.01,47.75 60.94,46.82 X1.1 63.18,46.82 C16.1
PA0_UART4_TX: length 19.4
  Top Layer w0.254: 67.78,58.47 67.78,58.42 67.77,58.41 60.83,58.41 53.17,50.75 51.58,50.75 ; 64.09,58.39 64.09,58.38
PA1_UART4_RX: length 20.7
  Top Layer w0.254: 68.32,60.89 67.85,60.44 61.98,60.44 52.79,51.24 51.59,51.24
PA2_TIM2_CH3: length 82.9
  Top Layer w0.254: 51.52,51.8 55.06,55.34 v1(55.06,58.09) ; 17.36,91.57 18.63,92.84 18.63,94.61 19.2,95.19 38.59,95.19 38.66,95.12 40.98,95.12 44.28,91.82 44.28,80.52 41.87,78.1 v1(41.87,72.14)
  内层2 w0.254: v1(41.87,72.14) 42.26,71.74 42.26,67.59 47.04,62.81 47.04,59.09 47.57,58.56 54.6,58.56 55.04,58.12
PA9_USART1_TX: length 26.6
  Top Layer w0.254: 12.53,24.89 12.53,26.03 15.07,28.57 21.67,28.57 24.85,31.75 24.85,34.42 v1(25.48,35.05) ; v1(26.12,38.1) 28.02,38.1 28.32,37.8 29.92,37.8
  内层2 w0.254: v1(26.12,38.1) 25.48,37.46 v1(25.48,35.05)
PA10_USART1_RX: length 23.7
  Top Layer w0.254: v1(26.12,31.37) 25.48,31.37 21.93,27.81 16.21,27.81 15.4,27 H2.3 ; 29.92,37.3 27.81,37.3 v1(27.64,37.46)
  内层2 w0.254: v1(26.12,31.37) 26.12,35.94 v1(27.64,37.46)
PA13_SWD_TMS: length 19
  Top Layer w0.254: 29.92,35.8 27,35.8 v1(26.76,35.56)
  内层2 w0.254: P3.4 24.09,44.2 24.6,43.69 24.6,39.24 25.16,38.68 28.08,38.68 28.53,38.23 28.53,37.34 v1(26.76,35.56)
PA14_SWD_CLK: length 19.5
  Top Layer w0.254: v1(31.96,29.72) 31.98,29.73 31.98,32.25
  内层2 w0.254: P3.2 24.9,35.51 24.9,34.81 25.36,34.35 25.36,30.99 26.63,29.72 v1(31.96,29.72)
PB3_SPI3_SCK: length 49.2
  Top Layer w0.305: 43.98,32.25 43.98,35.63 v1(44.03,35.69)
  内层2 w0.254: 68.03,7.14 69.38,8.49 69.38,20.69 68.59,21.48 64.73,21.48 52.91,33.29 ; 43.99,35.62 48.18,35.62 50.55,33.25 52.92,33.25
PB5_SPI3_MOSI: length 40.8
  Top Layer w0.305: 44.98,32.25 44.98,34.6 v1(44.92,34.66)
  内层2 w0.254: v1(44.92,34.66) 48.64,34.66 50.4,32.9 52.28,32.9 64.9,20.28 66.12,20.28 66.3,20.11 66.3,11.95 68.27,9.98
PB6_I2C1_SCL: length 59.9
  Top Layer w0.18: v1(42.51,51.96) 42.51,39.29 45.48,36.32 45.48,32.25
  内层1 w0.18: v1(42.51,51.96) 42.51,77.07 44.6,79.16 44.6,86.9 46.76,89.06 46.76,89.19
PB7_I2C1_SDA: length 68.3
  Top Layer w0.18: 46,36.56 46.01,36.58 46.01,36.84 45.82,37.03 43.62,39.23 43.62,50.39 43.4,50.61 43.4,50.72 v1(43.4,50.73) ; 46,36.56 46,32.38 45.98,32.36 45.98,32.26 45.98,32.25 ; 46,36.56 46,36.6 ; 46,36.56 46,36.56
  内层1 w0.18: v1(43.4,50.73) 42.14,50.73 40.82,52.05 40.82,76.74 43.47,79.39 43.47,92.77 44.76,94.06 46.66,94.06 46.68,94.04
PB11_TIM2_CH4: length 55.7
  Top Layer w0.254: 32.98,53.85 32.98,53.86 32.98,56.13 v1(33.11,56.26) ; v1(14.44,64.77) v1(21.04,64.77)
  内层2 w0.254: v1(33.11,56.26) 29.01,60.36 25.07,60.36 21.04,64.39 v1(21.04,64.77) ; 14.82,91.57 14.82,91.06 9.74,85.98 9.74,74.29 14.06,69.98 14.06,65.53 14.44,65.15 v1(14.44,64.77)
PB12_UART5_RX: length 16.4
  Top Layer w0.254: 29.92,51.8 29.57,51.8 29.17,52.21 29.17,61.09 30.06,61.98 33.61,61.98 34.25,62.61 H7.2
PB13_UART5_TX: length 16
  Top Layer w0.254: 29.81,51.19 28.9,51.19 28.53,51.56 28.53,62.49 29.29,63.26 31.58,63.26 31.71,63.39 H7.1
PB14_DIR: length 38.6
  Top Layer w0.254: 29.83,50.71 28.88,50.71 28.02,51.56 28.02,63.28 33.74,68.99 H5.3 ; v1(24.34,77.09) 24.34,79.21 U8.11
  内层2 w0.254: H5.3 33.74,69.72 30.06,73.41 30.06,75.44 28.41,77.09 v1(24.34,77.09)
PB14_DIR_CONV: length 16.4
  Top Layer w0.254: v1(25.48,81.91) 24.98,81.41 24.98,79.37 U8.12
  内层2 w0.254: v1(25.48,81.91) 27.05,81.91 32.6,87.47 32.6,91.57
PB15_DIR: length 34.2
  Top Layer w0.254: U8.14 26.25,79.25 v1(26.25,76.33) ; 29.83,50.21 28.87,50.21 27.52,51.56 27.52,65.4 H5.4
  内层2 w0.254: H5.4 31.2,69.47 27.64,73.02 27.64,74.93 v1(26.25,76.33)
PB15_DIR_CONV: length 13.9
  Top Layer w0.254: U8.15 26.83,79.32 26.83,82.53 v1(26.86,82.55)
  内层2 w0.254: 30.06,91.57 29.43,90.94 29.43,86.54 29.82,86.16 29.82,85.67 26.86,82.71 v1(26.86,82.55)
PC0_ADC1_INP10: length 14.3
  Top Layer w0.254: 51.52,46.8 v1(54.19,46.8)
  内层2 w0.254: v1(56.73,56.77) 56.73,56.26 55.52,55.06 55.52,47.06 55.27,46.8 v1(54.19,46.8)
PC6_TIM3_CH1: length 62.5
  Top Layer w0.254: v1(26.12,40.26) 26.16,40.3 29.92,40.3
  内层2 w0.254: 17.36,94.11 17.48,94.11 18.63,92.96 18.63,89.66 17.22,88.25 17.22,66.43 24.72,58.93 24.72,49.66 26.12,48.26 v1(26.12,40.26)
PC7_TIM3_CH2: length 69.6
  Top Layer w0.254: v1(25.48,39.37) 26.37,39.37 26.81,39.8 29.92,39.8
  内层2 w0.254: v1(25.48,39.37) 25.48,44.58 23.33,46.74 23.33,58.04 14.82,66.55 14.82,73.53 13.8,74.55 11.39,74.55 10.75,75.18 10.75,84.71 16.09,90.04 16.09,92.84 14.82,94.11
PC8_SDMMC1_D0: length 37
  Top Layer w0.254: 26.98,12.54 27.13,12.69 R29.2 27.13,20.59 27.31,20.77 28.23,20.77 28.41,20.95 28.41,22.11 28.23,22.29 27.31,22.29 27.13,22.47 27.13,23.63 27.31,23.81 28.23,23.81 28.41,23.99 28.41,25.16 28.23,25.34 27.31,25.34 27.13,25.52 27.13,26.15 31.33,30.35 31.33,33.06 33.74,35.47 33.74,38.23 32.66,39.3 29.92,39.3
PC9_SDMMC1_D1: length 37
  Top Layer w0.254: 25.88,12.54 25.88,15.6 25.86,15.62 25.86,16.52 25.48,16.89 24.98,16.89 24.29,17.58 24.29,19.53 24.11,19.71 23,19.71 22.82,19.89 22.82,21.05 23,21.23 24.11,21.23 24.29,21.41 24.29,22.57 24.11,22.75 23,22.75 22.82,22.93 22.82,24.1 23,24.28 24.11,24.28 24.29,24.46 24.29,25.09 30.69,31.5 30.69,33.27 31.71,34.29 31.71,38.61 31.51,38.8 29.92,38.8
PC10_SDMMC1_D2: length 37
  Top Layer w0.254: CARD1.1 33.49,12.62 R31.2 32.98,16.9 32.98,17.33 32.8,17.51 30.11,17.51 29.93,17.69 29.93,21.91 30.11,22.09 32.8,22.09 32.98,22.27 32.98,23.43 32.8,23.61 30.11,23.61 29.93,23.79 29.93,24.95 30.11,25.13 32.71,25.13 32.98,25.39 32.98,26.9 32.8,27.08 30.08,27.08 29.9,27.26 29.9,28.42 30.08,28.6 32.8,28.6 32.98,28.78 32.98,32.25
PC11_SDMMC1_D3: length 36.1
  Top Layer w0.254: 33.48,32.25 33.48,29.86 33.79,29.54 33.79,21.19 33.61,21.01 32.65,21.01 32.47,20.83 32.47,19.68 32.65,19.51 35.95,19.51 36.28,19.18 36.28,18.59 36.1,18.41 34.05,18.41 33.79,18.16 33.79,17.64 34.05,17.38 36.68,17.38 36.78,17.28 R27.2 36.78,11.47 36.53,11.22 32.73,11.22 32.48,11.47 32.48,12.54
PC12_SDMMC1_CK: length 36.4
  Top Layer w0.254: CARD1.5 29.18,11.55 30.57,10.16 39.45,10.16 39.71,10.41 39.71,16.87 34.63,21.95 34.63,30.4 33.98,31.06 33.98,32.25
PD2_SDMMC1_CMD: length 36.9
  Top Layer w0.254: v1(32.72,14.35) 31.57,14.35 R28.2 31.38,14.23 31.38,12.54 ; v1(36.66,21.72) 35.48,22.9 35.48,32.25
  内层2 w0.254: v1(32.72,14.35) 32.72,15.52 32.96,15.75 41.11,15.75 41.11,17.27 40.79,17.59 40.79,17.84 41.62,18.67 41.62,18.92 40.79,19.74 40.54,19.74 39.71,18.92 39.46,18.92 38.64,19.74 38.64,20 39.46,20.82 39.46,21.08 38.64,21.9 38.38,21.9 37.56,21.07 37.3,21.07 v1(36.66,21.72)
PD8_DIR: length 49.2
  Top Layer w0.254: 29.73,49.73 28.71,49.73 27.01,51.43 27.01,67.44 H5.5 28.15,69.09 24.47,72.77 14.56,72.77 13.29,74.04 13.29,80.64 13.55,80.9 15.2,80.9 15.38,80.72 15.38,79.56 U9.3
PD8_DIR_CONV: length 26.2
  Top Layer w0.254: v1(20.68,85.22) 20.68,77.37 20.02,76.71 14.97,76.71 14.72,76.96 U9.2
  内层2 w0.254: v1(20.68,85.22) 27.03,91.57 U10.10
PD9_DIR: length 50.2
  Top Layer w0.254: U9.5 16.72,79.61 16.72,80.52 15.83,81.41 13.29,81.41 12.78,80.9 12.78,73.53 14.18,72.14 23.07,72.14 H5.6 26.5,68.71 26.5,51.31 28.6,49.21 29.84,49.21
PD9_DIR_CONV: length 22.2
  Top Layer w0.254: v1(20.1,86.11) 20.1,77.67 19.77,77.34 16.27,77.34 16.02,77.6 U9.4
  内层2 w0.254: 24.98,91.57 24.98,90.98 v1(20.1,86.11)
PD10_DIR: length 52.4
  Top Layer w0.254: U9.7 17.97,80.42 16.47,81.91 13.04,81.91 12.28,81.15 12.28,73.02 13.67,71.63 21.04,71.63 H5.7 25.99,66.67 25.99,51.05 28.36,48.69 29.81,48.69
PD10_DIR_CONV: length 18.3
  Top Layer w0.254: v1(19.52,86.99) 19.52,78.23 19.26,77.98 17.48,77.98 17.32,78.15 U9.6
  内层2 w0.254: v1(19.52,86.99) 22.44,89.92 22.44,91.57
PD11_DIR: length 54.6
  Top Layer w0.254: U9.9 18.62,83.68 17.48,82.55 12.78,82.55 11.77,81.53 11.77,72.77 13.67,70.87 19.26,70.87 H5.8 25.36,64.77 25.36,51.05 28.25,48.16 29.79,48.16
PD11_DIR_CONV: length 6.8
  Top Layer w0.254: U9.10 v1(17.97,87.1)
  内层2 w0.254: v1(17.97,87.1) 19.9,89.03 U10.16
PD12_TIM4_CH1: length 48.9
  Top Layer w0.254: v1(31.96,48.26) 31.96,48.19 31.51,47.74 29.99,47.74 ; U7.11 35.05,83.91 35.9,83.06 35.9,78.99 34.25,77.34 29.68,77.34 28.79,76.45 H4.5 28.79,72.26 v1(27.39,70.87)
  内层2 w0.254: v1(27.39,70.87) 27.39,68.58 28.15,67.82 28.15,62.23 33.69,56.69 33.69,50.11 31.96,48.39 v1(31.96,48.26)
PD12_TIM4_CH1_CONV: length 14
  Top Layer w0.254: U7.12 33.03,83.26 28.91,87.38 28.91,92.71 27.52,94.11
PD13_TIM4_CH2: length 49.3
  Top Layer w0.254: 29.99,47.24 33.01,47.24 33.05,47.28 v1(33.05,47.34) ; U7.14 34.84,81.96 35.39,81.41 35.39,79.88 33.99,78.49 29.55,78.49 28.02,76.96 28.02,75.95 H4.6
  内层2 w0.254: H4.6 26.25,73.28 29.93,69.6 29.93,61.98 34.5,57.4 34.5,48.8 v1(33.05,47.34)
PD13_TIM4_CH2_CONV: length 17.5
  Top Layer w0.254: U7.15 32.32,81.31 28.15,85.47 28.15,88.01 26.37,89.79 26.37,92.84 25.1,94.11 24.98,94.11
PD14_TIM4_CH3: length 49
  Top Layer w0.254: U8.3 26.21,84.29 23.96,82.04 22.69,82.04 21.93,81.28 21.93,75.95 H4.7 ; 29.86,45.73 25.35,45.73 23.82,47.26 23.82,63.3 24.6,64.08 v1(24.6,64.13)
  内层2 w0.254: H4.7 23.83,74.17 24.98,73.02 24.98,64.52 v1(24.6,64.13)
PD14_TIM4_CH3_CONV: length 10.6
  Top Layer w0.254: 22.44,94.11 23.71,92.84 23.71,90.3 26.86,87.15 U8.2
PD15_TIM4_CH4: length 49.1
  Top Layer w0.254: 29.87,45.25 26.21,45.25 26.2,45.26 24.88,45.26 23.07,47.07 23.07,50.49 22.69,50.87 v1(22.69,64.9) ; H4.8 21.17,81.66 22.18,82.68 23.83,82.68 24.91,83.75 U8.5
  内层2 w0.254: H4.8 22.31,73.02 22.31,65.28 v1(22.69,64.9)
PD15_TIM4_CH4_CONV: length 11.2
  Top Layer w0.254: 19.9,94.11 21.17,92.84 21.17,90.93 25.56,86.54 U8.4
PE0_UART8_RX: length 21.4
  Top Layer w0.254: 51.93,17.56 51.93,16.39 51.18,15.64 49.09,15.64 48.22,16.51 48.25,18.19 ; 48.25,18.19 48.25,21.72 47.98,22 47.98,32.25 ; 48.25,18.19 48.25,18.15
PE1_UART8_TX: length 14.9
  Top Layer w0.254: 49.61,17.86 49.67,17.92 49.67,20.8 48.48,22 48.48,32.25
PE2_EXIT2_KEY1: length 20.6
  Top Layer w0.305: 66.89,40.57 66.89,40.57 66.89,40.1 64.41,37.62 62.42,37.62 62.2,37.41 62.2,34.29 61.09,33.17 54.8,33.17 53.74,34.24 51.93,34.24
PE3_EXIT3_KEY2: length 65.8
  Top Layer w0.254: 45.76,46.7 45.76,38.78 49.81,34.73 51.51,34.73 ; 65.16,84.58 65.57,84.16 v1(65.57,79.68)
  Top Layer w0.508: 65.34,84.76 65.62,84.48 66.87,84.48
  内层2 w0.254: v1(45.87,46.78) 45.9,46.75 46.54,46.75 46.93,47.14 46.93,47.8 61.41,62.27 61.41,79.31 61.78,79.68 v1(65.57,79.68)
PE4_EXIT4_KEY3: length 70.7
  Top Layer w0.254: v1(64.41,82.5) 64.41,91.22 65.43,92.25 ; 46.33,47.49 46.33,47.43 46.62,47.14 46.62,38.89 50.26,35.24 50.99,35.24
  Top Layer w0.508: 67.03,92.02 65.55,92.02 65.37,92.19 65.33,92.23
  内层2 w0.254: 64.74,82.17 v1(64.41,82.5) 62.31,82.5 60.93,81.12 60.93,62.67 46.29,48.03 v1(46.29,47.57)
PE9_TIM1_CH1: length 32.1
  Top Layer w0.254: U7.3 38.73,81.96 38.44,81.66 38.44,78.1 38.95,77.6 H4.1 ; v1(38.64,57.6) 37.98,56.94 37.98,53.85
  内层2 w0.254: v1(38.64,57.6) 41.49,60.45 41.49,70.87 38.95,73.41 H4.1
PE9_TIM1_CH1_CONV: length 18.5
  Top Layer w0.254: 37.68,94.11 39.45,94.11 43.14,90.42 43.14,82.8 41.64,81.31 U7.2
PE10_DIR: length 43.7
  Top Layer w0.254: v1(23.61,83.44) U8.7 ; 36.48,53.85 36.48,57.45 v1(36.69,57.66)
  内层2 w0.254: v1(23.61,83.44) 23.27,83.11 23.27,81.08 23.71,80.64 30.18,80.64 35.14,75.69 35.14,72.77 H5.1 38.69,68.96 38.69,66.93 39.84,65.79 39.84,61.98 36.69,58.83 v1(36.69,57.66)
PE10_DIR_CONV: length 19.8
  Top Layer w0.254: U8.6 v1(24.26,86.87) ; v1(31.2,84.07) 29.36,85.92 v1(29.23,85.92)
  内层2 w0.254: v1(29.23,85.92) 28.28,86.87 v1(24.26,86.87) ; v1(31.2,84.07) 37.68,90.55 U10.2
PE11_TIM1_CH2: length 34.1
  Top Layer w0.254: v1(37.55,67.31) 37.55,72.62 36.41,73.76 H4.2 36.41,74.68 37.93,76.2 37.93,82.8 38.44,83.31 39.86,83.31 U7.5 ; 35.98,53.85 v1(35.98,58.5)
  内层2 w0.254: v1(37.55,67.31) 37.55,66.17 38.95,64.77 38.95,62.41 36.03,59.49 36.03,58.55 v1(35.98,58.5)
PE11_TIM1_CH2_CONV: length 17.5
  Top Layer w0.254: U7.4 41.29,82.61 42.38,83.69 42.38,88.9 38.44,92.84 36.41,92.84 35.14,94.11
PE12_DIR: length 37.1
  Top Layer w0.254: 35.48,53.85 35.48,57.7 v1(35.36,57.82) ; v1(22.95,77.85) 22.95,79.28 U8.9
  内层2 w0.254: v1(35.36,57.82) 35.36,60.29 38.19,63.12 38.19,64.52 36.53,66.17 36.53,68.83 H5.2 36.28,69.72 32.6,73.41 32.6,75.18 29.93,77.85 v1(22.95,77.85)
PE12_DIR_CONV: length 19
  Top Layer w0.254: U8.10 23.61,80.8 v1(24.09,81.28)
  内层2 w0.254: v1(24.09,81.28) 27.39,81.28 35.14,89.03 U10.4
PE13_TIM1_CH3: length 35.8
  Top Layer w0.254: v1(33.8,71.06) 33.8,74.1 H4.3 34.12,74.17 37.17,77.22 37.17,83.69 38.06,84.58 39.89,84.58 U7.7 ; 34.98,53.85 34.98,57.37 34.5,57.85 v1(34.5,59.05)
  内层2 w0.254: v1(33.8,71.06) 35.01,69.85 35.01,67.94 35.52,67.44 35.52,62.61 34.5,61.59 v1(34.5,59.05)
PE13_TIM1_CH3_CONV: length 16.8
  Top Layer w0.254: 32.6,94.11 33.94,92.76 33.94,90.73 34.63,90.04 36.92,90.04 41.74,85.22 41.74,84.58 41.11,83.95 39.96,83.95 U7.6
PE14_TIM1_CH4: length 39.2
  Top Layer w0.254: U7.9 34.04,85.33 35.53,85.33 36.53,84.33 36.53,78.23 34.88,76.58 31.83,76.58 31.33,76.07 H4.4 v1(31.33,70.74) ; 34.48,53.85 34.49,53.85 34.49,54.79 34.12,55.16 34.12,57.02 33.36,57.78 33.36,58.67 v1(33.74,59.05)
  内层2 w0.254: v1(33.74,59.05) 33.74,61.47 33.11,62.1 33.11,67.69 32.47,68.33 32.47,69.6 v1(31.33,70.74)
PE14_TIM1_CH4_CONV: length 11.8
  Top Layer w0.254: U7.10 32.88,84.56 31.33,86.11 31.33,92.84 30.06,94.11
PF0_I2C2_SDA: length 54.5
  Top Layer w0.18: v1(53.87,38.95) 53.65,38.73 52.44,38.73 52.36,38.8 ; 57.22,83.32 56.12,84.42 56.12,86.97
  内层1 w0.18: v1(57.19,83.37) 60.73,79.82 60.73,46.98 53.87,40.12 v1(53.87,38.95)
PF1_I2C2_SCL: length 56.3
  Top Layer w0.18: 59.75,82.9 57.09,85.56 57.09,86.95 ; 52.27,39.25 52.3,39.22 52.98,39.22 53.29,39.53 v1(54.75,39.53)
  内层1 w0.18: 62.16,45.8 62.16,45.74 ; 62.16,45.8 62.16,45.57 55.94,39.35 54.93,39.35 v1(54.75,39.53) ; 62.16,45.8 62.16,45.8 62.16,80.63 59.84,82.95 v1(59.78,82.95)
PF6_UART7_RX: length 47.8
  Top Layer w0.18: 51.83,42.71 53.46,42.71 54.76,44.01 v1(54.76,44.22) ; 48.94,66.27 47.6,67.61 47.6,72.11 47.97,72.48 57.44,72.48 58.5,73.54
  内层1 w0.18: 46.54,64.19 46.54,53.66 54.76,45.44 v1(54.76,44.22) ; 48.67,66.09 48.44,66.09 46.56,64.21
PF7_UART7_TX: length 43.4
  Top Layer w0.18: 55.87,71.26 57.82,71.26 58.16,71.6 ; 55.87,71.26 51.4,71.26 ; 55.87,71.26 55.89,71.29 ; v1(53.64,44.42) 53.64,44.16 52.7,43.22 51.56,43.22 51.47,43.31 ; 48.86,68.7 51.4,71.25
  内层1 w0.18: 46.48,67.08 48.46,69.06 ; v1(53.64,44.42) 53.64,44.98 45.43,53.19 45.43,65.99 46.49,67.05 ; 48.4,68.99 48.99,68.99 ; 49.1,68.43 49.2,68.43
PF14_I2C4_SCL: length 41.1
  Top Layer w0.18: 41.02,54.69 41.02,55.34 41.31,55.63 41.31,69.12 ; 41.32,69.12 46.39,74.19 46.39,77.69 47.17,78.48 51.46,78.48 55.11,82.12 FPC1.4
PF15_I2C4_SDA: length 41.8
  Top Layer w0.18: 51.01,79.05 54,82.04 54,87.3 FPC1.2 ; 51.01,79.05 51,79.04 ; 51.01,79.05 44.91,79.05 44.75,78.89 ; 40.66,69.43 43.05,71.82 43.05,77.23 ; 43.08,77.25 44.71,78.88 ; 40.63,69.39 40.54,69.31 40.54,54.68
PG13_SPI3_CS: length 37.3
  Top Layer w0.305: v1(40.98,34.16) 41.48,33.67 41.48,32.25
  内层1 w0.254: v1(50.14,27.84) 54.6,23.38 54.6,21.4 56.45,19.55 62.9,19.55 65.09,17.36 67.86,17.36
  Bottom Layer w0.254: v1(40.98,34.16) 40.98,33.91 47.05,27.84 v1(50.14,27.84)
PG14_DC: length 43.7
  Top Layer w0.305: 41.98,32.25 41.98,34.05 v1(40.96,35.07)
  内层1 w0.254: 64.8,19.15 63.34,20.61 56.89,20.61 55.66,21.84 55.66,23.82 v1(50.81,28.67) ; 64.8,19.15 65.26,18.68 68.8,18.68 69.15,18.33 69.15,15.36 68.59,14.8 68.26,14.8 ; 64.8,19.15 64.86,19.1
  Bottom Layer w0.254: v1(50.81,28.67) 47.36,28.67 40.96,35.07 v1(40.96,35.07)
PG15_RES: length 43
  Top Layer w0.305: 43.48,32.25 43.48,34.37 v1(43.35,34.49)
  内层1 w0.254: 51.37,29.53 52.26,28.64 56.97,28.64 64.34,21.27 69.01,21.27 69.6,20.68 69.6,14.15 67.94,12.49
  Bottom Layer w0.254: v1(43.35,34.49) 48.36,29.48 v1(51.25,29.48)
RESET: length 98.2
  Top Layer w0.254: 63.47,25.51 63.58,25.61 63.58,27.14 ; 62.08,27.47 62.14,27.4 63.46,27.4 ; 67.18,22.81 64.99,22.81 63.52,24.29 C18.1 ; 24.91,28.57 20.42,24.08 20.42,12.49 19.75,11.82 17.92,11.82
  Top Layer w0.305: v1(48.55,43.59) 48.55,44.37 50.43,46.25 51.21,46.25
  内层2 w0.254: v1(44.76,40.83) 48.49,40.83 48.55,40.77 ; 50.03,39.3 48.55,40.77 ; 50.03,39.3 61.98,27.34 ; 50.03,39.3 50.07,39.3 ; 48.55,40.77 v1(48.55,43.59) ; 39.5,28.53 24.86,28.53 24.83,28.56
  Bottom Layer w0.254: v1(39.54,28.56) 39.58,28.56 39.99,28.97 39.99,36.06 v1(44.76,40.83)
  Bottom Layer w0.508: 24.79,28.54 24.79,34.53 22.97,36.36 21.54,36.36
  vias: v1(24.85,28.54) v1(61.98,27.41)
SPK+: length 8.4
  Top Layer w0.254: 57.87,24.59 62.02,20.44 62.02,17.9
SPK-: length 5.5
  Top Layer w0.254: 57.77,22.22 59.69,20.31 59.69,17.54
SW4: length 2.8
  Top Layer w0.5: U2.1 3.13,72.58 C1.2
UD2+: length 9.4
  Top Layer w0.254: USB2.6 6.95,13.46 7.2,13.21 7.2,12.79 6.86,12.46 ; USB2.8 6.86,12.46 ; 6.86,12.46 7.64,11.68 12.02,11.68 12.28,11.43 U5.1
UD2-: length 11.9
  Top Layer w0.254: USB2.7 6.2,13.03 5.6,13.03 5.29,13.34 5.29,13.59 5.67,13.97 6.26,13.97 USB2.5 7.08,13.96 8.85,12.19 12.78,12.19 13.55,11.43 U5.2
UD+: length 31.4
  Top Layer w0.254: 6.91,25.52 10.75,25.52 14.44,29.21 21.04,29.21 24.21,32.38 24.21,34.67 25.85,36.3 29.92,36.3 ; 6.91,25.52 7.2,25.24 7.2,24.76 6.95,24.52 6.27,24.52 ; 6.91,25.52 6.27,25.52
UD-: length 31.9
  Top Layer w0.254: 29.92,36.8 25.46,36.8 23.58,34.92 23.58,32.77 20.66,29.84 14.06,29.84 10.23,26.02 5.64,26.02 5.4,25.78 5.4,25.3 5.73,24.97 6.21,24.97 6.27,25.02
$1N2342: length 6.3
  Top Layer w0.254: 6.27,26.52 4.93,26.52 4.28,27.17 R15.2
$1N2433: length 5.8
  Top Layer w0.254: R16.2 4.38,22.97 4.94,23.52 6.27,23.52
$1N3026: length 8.5
  Top Layer w0.254: USB2.4 4.1,14.46 2.75,15.81 2.75,18.02 2.31,18.47 1.95,18.47 R17.2
$1N3032: length 6
  Top Layer w0.254: R18.2 4.02,7.63 4.02,10.67 4.81,11.46 USB2.10
$1N3369: length 5.7
  Top Layer w0.254: U5.6 14.82,14.6 13.68,13.47 R21.1
$1N3371: length 1.9
  Top Layer w0.254: U5.4 17.89,10.4 R20.2
$1N3372: length 2
  Top Layer w0.254: U5.8 12.28,16.57 C20.2
$1N3373: length 6
  Top Layer w0.254: R19.1 9.3,13.54 9.3,13.91 9.54,14.15 12.84,14.15 13.55,14.86 U5.7
$1N5920: length 5.1
  Top Layer w0.254: C37.1 26.44,34.22 27.52,35.31 29.92,35.31 29.92,35.3
$1N6077: length 2.8
  Top Layer w0.305: 50.92,30.67 49.06,30.67 48.98,30.75 48.98,31.57
$1N6160: length 11.9
  Top Layer w0.35: 51.54,36.77 C38.1
  Top Layer w0.5: 60.47,36.77 60.47,35.23 60.65,35.05 D4.2 ; 60.47,36.77 C38.1 ; 60.47,36.77 61.09,36.77 D5.2
$1N6699: length 6.9
  Top Layer w0.254: 32.48,53.85 32.48,60.14 32.91,60.58
$2N901: length 2.8
  Top Layer w0.5: C1.1 1.36,76.05 U2.8
$2N906: length 2.2
  Top Layer w0.5: U2.3 5.67,70.17 C2.2
$2N907: length 2
  Top Layer w0.5: C2.1 R4.2
$2N910: length 4.6
  Top Layer w0.254: U2.6 5.67,76.96 6.82,75.81 R3.2
$2N3702: length 1.7
  Top Layer w0.254: LED1.2 11.24,31.25 R34.1

## Copper pours and planes (outline as drawn; the poured copper is in the pictures)
1V2 on Top Layer: 3.88,49.53 7.7,49.53 7.7,45.72 3.88,45.72
3V32 on Top Layer: 13.07,49.5 17.1,49.5 17.1,46.54 13.07,46.54
3V32 on Top Layer: 20.65,47.17 26.03,47.17 26.03,43.21 20.65,43.21
3V32 on Top Layer: 16.75,50.42 22.56,50.42 22.56,45.59 16.75,45.59
3V32 on Bottom Layer: 25.7,46.8 45.31,46.8 45.31,43.08 25.7,43.08
3V32 on Bottom Layer: 20.22,50.44 26.06,50.44 26.06,43.07 20.22,43.07
3V32_2 on Top Layer: 8.85,39.24 17.36,39.24 17.36,32.27 8.85,32.27
3V32_2 on Top Layer: 16.85,38.23 18.78,38.23 18.78,30.53 16.85,30.53
3V32_2 on Top Layer: 18.62,35.36 22.93,35.36 22.93,30.66 18.62,30.66
3V32_2 on Bottom Layer: 18.69,34.85 22.92,34.85 22.92,30.65 18.69,30.65
5V_IN on Top Layer: 8.65,67.44 12.96,67.44 12.96,61.88 8.65,61.88
5V_IN on Top Layer: 10.39,64.41 15.33,64.41 15.33,52.04 10.39,52.04
5V_IN on Top Layer: 5.71,53.2 9.03,53.2 9.03,51.89 5.71,51.89
5V_IN on Top Layer: 5.81,15.82 8.48,15.82 8.48,13.36 5.81,13.36
5V_IN on Top Layer: 12.13,55.93 19.77,55.93 19.77,52.07 12.13,52.07
5V_IN on Top Layer: 14.79,46 19.77,46 19.77,39.12 14.79,39.12
5V_IN on Top Layer: 5.95,28.92 11.38,28.92 11.38,26.86 5.95,26.86
5V_IN on Top Layer: 5.92,11.03 11.52,11.03 11.52,8.2 5.92,8.2
